# EasyEDA Pro project pmod_adapter.eprj

# Schematic Schematic1
Board Name: Board1; Create Date: 2026-10-15; Page Name: P1; Project Name: PMOD_Adapter board; Schematic Name: Schematic1; Update Date: 2026-10-17; Company: 嘉立创EDA; Page Size: A4; Version: V1.0
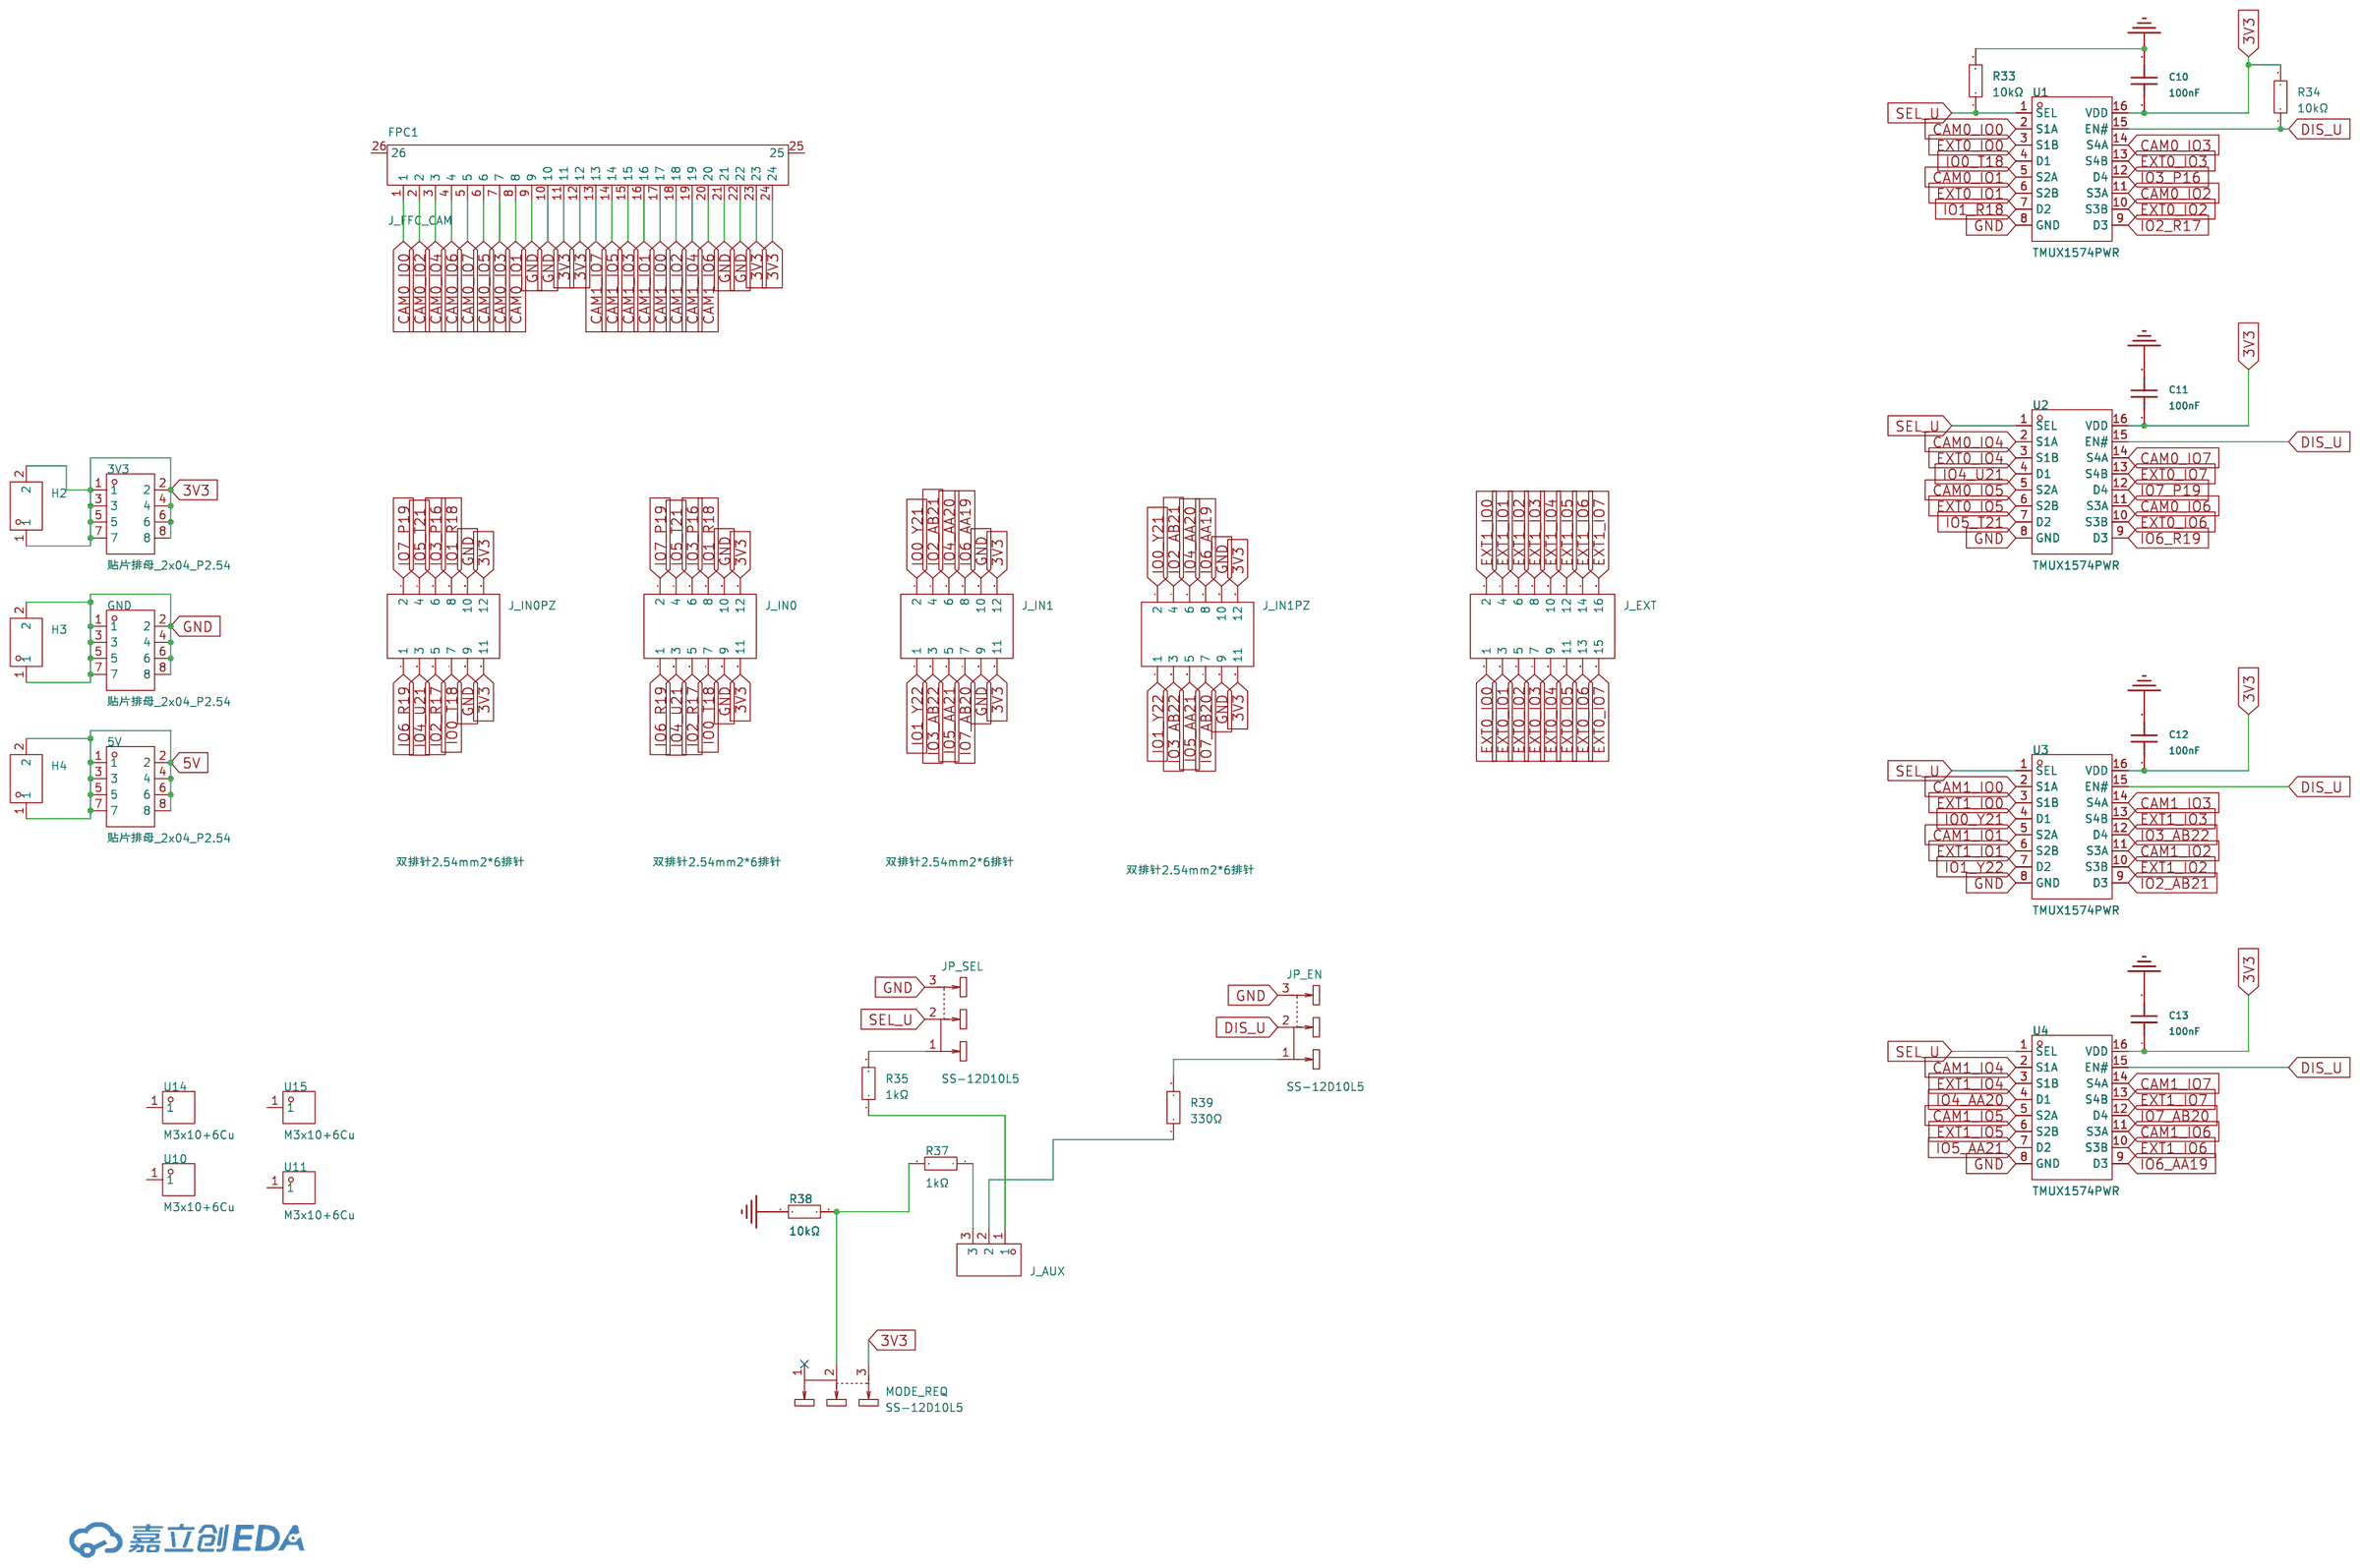
[diagram p0: schematic sheet]

## Parts
3V3  贴片排母_2x04_P2.54  [HDR-SMD_8P-P2.54-V-F-R2-C4-S7.1]
5V  贴片排母_2x04_P2.54  [HDR-SMD_8P-P2.54-V-F-R2-C4-S7.1]
C10  100nF  [C0603]
C11  100nF  [C0603]
C12  100nF  [C0603]
C13  100nF  [C0603]
FPC1  J_FFC_CAM  [FPC-SMD_24P-P0.50_MLD-FPC-05F-24P-H15]
GND  贴片排母_2x04_P2.54  [HDR-SMD_8P-P2.54-V-F-R2-C4-S7.1]
H2  -  [HDR-TH_2P-P2.54-V-M-2]
H3  -  [HDR-TH_2P-P2.54-V-M-2]
H4  -  [HDR-TH_2P-P2.54-V-M-2]
J_AUX  -  [HDR-TH_3P-P2.54-V-M]
J_EXT  -  [HDR-TH_16P-P2.54-V-M-R2-C8-S2.54]
J_IN0  双排针2.54mm2*6排针  [HDR-TH_12P-P2.54-V-M-R2-C6-S2.54]
J_IN0PZ  双排针2.54mm2*6排针  [HDR-TH_12P-P2.54-V-M-R2-C6-S2.54]
J_IN1  双排针2.54mm2*6排针  [HDR-TH_12P-P2.54-V-M-R2-C6-S2.54]
J_IN1PZ  双排针2.54mm2*6排针  [HDR-TH_12P-P2.54-V-M-R2-C6-S2.54]
JP_EN  SS-12D10L5  [SW-TH_SS-12D10L5]
JP_SEL  SS-12D10L5  [SW-TH_SS-12D10L5]
MODE_REQ  SS-12D10L5  [SW-TH_SS-12D10L5]
R33  10kΩ  [R0805]
R34  10kΩ  [R0805]
R35  1kΩ  [R0805]
R37  1kΩ  [R0805]
R38  10kΩ  [R0805]
R39  330Ω  [R0805]
U1  TMUX1574PWR  [TSSOP-16_L5.0-W4.4-P0.65-LS6.4-BL]
U2  TMUX1574PWR  [TSSOP-16_L5.0-W4.4-P0.65-LS6.4-BL]
U3  TMUX1574PWR  [TSSOP-16_L5.0-W4.4-P0.65-LS6.4-BL]
U4  TMUX1574PWR  [TSSOP-16_L5.0-W4.4-P0.65-LS6.4-BL]
U10  M3x10+6Cu  [SMD_L4.7-W4.7-D3.0]
U11  M3x10+6Cu  [SMD_L4.7-W4.7-D3.0]
U14  M3x10+6Cu  [SMD_L4.7-W4.7-D3.0]
U15  M3x10+6Cu  [SMD_L4.7-W4.7-D3.0]

## Library data of the parts
3V3 5V GND = 贴片排母_2x04_P2.54: Supplier Part: C9900001627; Supplier Footprint: SMD-8_L10.16-W5.0-P2.54-LS7.14; JLCPCB Part Class: 扩展库; Supplier: LCSC
C10-C13 = CC0603KRX7R9BB104: 容值:100nF;精度:±10%;额定电压:50V;温度系数:X7R;; LCSC Part Name: 100nF ±10% 50V; Supplier Part: C14663; Manufacturer: YAGEO(国巨); Supplier Footprint: 0603; JLCPCB Part Class: 基础库; Datasheet: https://item.szlcsc.com/datasheet/CC0603KRX7R9BB104/15331.html; Supplier: LCSC; Tolerance: ±10%; Voltage Rating: 50V; Temperature Coefficient: X7R
FPC1 = MLD-FPC-05F-24P-H15: LCSC Part Name: 0.5PH 1.5H 掀盖FPC 24P; Supplier Part: C54333838; Manufacturer: Minlenda(敏连达); Supplier Footprint: SMD,P=0.5mm,卧贴; JLCPCB Part Class: 扩展库; Datasheet: https://item.szlcsc.com/datasheet/MLD-FPC-05F-24P-H15/57627873.html; Supplier: LCSC
H2-H4 = HDR-M_2.54_2x1: Supplier Part: C2883961; Supplier Footprint: 插件,P=2.54mm; JLCPCB Part Class: 扩展库
J_AUX = HDR-M_2.54_1x3P: Supplier Part: C2937625; Supplier Footprint: 插件; JLCPCB Part Class: 扩展库
J_EXT = HDR-M_2.54_2x8: Supplier Part: C68234; Supplier Footprint: 插件,P=2.54mm; JLCPCB Part Class: 扩展库
J_IN0 J_IN0PZ J_IN1 J_IN1PZ = 双排针2.54mm2*6排针: LCSC Part Name: 双排针2*6  间距2.54mm; Supplier Part: C66689; Supplier Footprint: 插件; JLCPCB Part Class: 扩展库; Supplier: LCSC
JP_EN JP_SEL MODE_REQ = SS-12D10L5: LCSC Part Name: 柄长5mm 直插双档 滑动开关; Supplier Part: C319012; Manufacturer: XKB Connection(中国星坤); Supplier Footprint: 插件,13x6.8mm; JLCPCB Part Class: 扩展库; Datasheet: https://item.szlcsc.com/datasheet/SS-12D10L5/300104.html; Supplier: LCSC; Circuit: 单刀双掷; Actuator Style: 矩形柱状; Termination Style: PC引脚; Length: 13mm; Width: 6.8mm; Switch Height: 6.4mm; Mounting Type: 直插; Actuator Color: 黑色; Current Rating: 3A; Voltage Rating: 125V; Life: 1万次; Operating Temperature: -40℃~+85℃
R33 R34 R38 = 0805W8F1002T5E_C17414: 电阻类型:厚膜电阻;阻值:10kΩ;精度:±1%;功率:125mW;工作电压:150V;温度系数:±100ppm/℃;; LCSC Part Name: 厚膜电阻 10kΩ ±1%; Supplier Part: C17414; Manufacturer: UNI-ROYAL(厚声); Manufacturer Part: 0805W8F1002T5E; Supplier Footprint: 0805; JLCPCB Part Class: 基础库; Datasheet: https://item.szlcsc.com/datasheet/0805W8F1002T5E/18102.html; Supplier: LCSC; Type: 厚膜电阻; Tolerance: ±1%; Power(Watts): 125mW; Voltage-Supply(Max): 150V; Temperature Coefficient: ±100ppm/℃; Operating Temperature: -55℃~+155℃
R35 R37 = 0805W8F1001T5E: LCSC Part Name: 1kΩ ±1% 125mW 厚膜电阻; Supplier Part: C17513; Manufacturer: UNI-ROYAL(厚声); Supplier Footprint: 0805; JLCPCB Part Class: 基础库; Datasheet: https://atta.szlcsc.com/upload/public/pdf/source/20200306/C422600_1E6D84923E4A46A82E41ADD87F860B5C.pdf; Supplier: LCSC; Type: 厚膜电阻; Tolerance: ±1%; Power(Watts): 125mW; Overload Voltage (Max): 150V; Temperature Coefficient: ±100ppm/℃; Operating Temperature Range: -55℃~+155℃
R39 = 0805W8F3300T5E: LCSC Part Name: 厚膜电阻 330Ω ±1%; Supplier Part: C17630; Manufacturer: UNI-ROYAL(厚声); Supplier Footprint: 0805; JLCPCB Part Class: 基础库; Datasheet: https://item.szlcsc.com/datasheet/0805W8F3300T5E/18318.html; Supplier: LCSC; Type: 厚膜电阻; Tolerance: ±1%; Power(Watts): 125mW; Voltage-Supply(Max): 150V; Temperature Coefficient: ±100ppm/℃; Operating Temperature: -55℃~+155℃
U1-U4 = TMUX1574PWR: LCSC Part Name: TMUX1574低电容、2:1(SPDT)4通道断电保护开关; Supplier Part: C2673443; Manufacturer: TI(德州仪器); Supplier Footprint: TSSOP-16; JLCPCB Part Class: 扩展库; Datasheet: https://www.ti.com/cn/lit/ds/symlink/tmux1574.pdf; Supplier: LCSC; Switch Circuit: 2:1; Number of Channels: 4; Ron: 2Ω; Voltage - Supply: 1.5V~5.5V; Con: 7.5pF; Turn-on time: 35ns; Bandwidth: 2GHz; Operating Temperature: -40℃~+125℃; Propagation Delay (tpd): 95ps; Features: 双向模拟通道；断电隔离；故障保护；失效安全断开
U10 U11 U14 U15 = M3x10+6Cu: M3x10+6; LCSC Part Name: Shuntian(顺天五金) 单头六角隔离铜柱螺柱 M3X10+6 国标 黄铜 袋装; Supplier Part: C551322; Manufacturer: Shuntian(顺天五金); JLCPCB Part Class: 扩展库; Datasheet: https://item.szlcsc.com/datasheet/M3x10%252B6Cu/575012.html; Supplier: LCSC

## Nets
3V3: 3V3.1 3V3.2 3V3.3 3V3.4 3V3.5 3V3.6 3V3.7 3V3.8 C10.1 C11.1 C12.1 C13.1 FPC1.11 FPC1.12 FPC1.23 FPC1.24 H2.1 H2.2 J_IN0.11 J_IN0.12 J_IN0PZ.11 J_IN0PZ.12 J_IN1.11 J_IN1.12 J_IN1PZ.11 J_IN1PZ.12 MODE_REQ.3 R34.2 U1.16(VDD) U2.16(VDD) U3.16(VDD) U4.16(VDD)
5V: 5V.1 5V.2 5V.3 5V.4 5V.5 5V.6 5V.7 5V.8 H4.1 H4.2
GND: C10.2 C11.2 C12.2 C13.2 FPC1.9 FPC1.10 FPC1.21 FPC1.22 GND.1 GND.2 GND.3 GND.4 GND.5 GND.6 GND.7 GND.8 H3.1 H3.2 J_IN0.9 J_IN0.10 J_IN0PZ.9 J_IN0PZ.10 J_IN1.9 J_IN1.10 J_IN1PZ.9 J_IN1PZ.10 JP_EN.3 JP_SEL.3 R33.2 R38.1 U1.8(GND) U2.8(GND) U3.8(GND) U4.8(GND)
CAM0_IO0: FPC1.1 U1.2(S1A)
CAM0_IO1: FPC1.8 U1.5(S2A)
CAM0_IO2: FPC1.2 U1.11(S3A)
CAM0_IO3: FPC1.7 U1.14(S4A)
CAM0_IO4: FPC1.3 U2.2(S1A)
CAM0_IO5: FPC1.6 U2.5(S2A)
CAM0_IO6: FPC1.4 U2.11(S3A)
CAM0_IO7: FPC1.5 U2.14(S4A)
CAM1_IO0: FPC1.17 U3.2(S1A)
CAM1_IO1: FPC1.16 U3.5(S2A)
CAM1_IO2: FPC1.18 U3.11(S3A)
CAM1_IO3: FPC1.15 U3.14(S4A)
CAM1_IO4: FPC1.19 U4.2(S1A)
CAM1_IO5: FPC1.14 U4.5(S2A)
CAM1_IO6: FPC1.20 U4.11(S3A)
CAM1_IO7: FPC1.13 U4.14(S4A)
DIS_U: JP_EN.2 R34.1 U1.15(EN#) U2.15(EN#) U3.15(EN#) U4.15(EN#)
EXT0_IO0: J_EXT.1 U1.3(S1B)
EXT0_IO1: J_EXT.3 U1.6(S2B)
EXT0_IO2: J_EXT.5 U1.10(S3B)
EXT0_IO3: J_EXT.7 U1.13(S4B)
EXT0_IO4: J_EXT.9 U2.3(S1B)
EXT0_IO5: J_EXT.11 U2.6(S2B)
EXT0_IO6: J_EXT.13 U2.10(S3B)
EXT0_IO7: J_EXT.15 U2.13(S4B)
EXT1_IO0: J_EXT.2 U3.3(S1B)
EXT1_IO1: J_EXT.4 U3.6(S2B)
EXT1_IO2: J_EXT.6 U3.10(S3B)
EXT1_IO3: J_EXT.8 U3.13(S4B)
EXT1_IO4: J_EXT.10 U4.3(S1B)
EXT1_IO5: J_EXT.12 U4.6(S2B)
EXT1_IO6: J_EXT.14 U4.10(S3B)
EXT1_IO7: J_EXT.16 U4.13(S4B)
IO0_T18: J_IN0.7 J_IN0PZ.7 U1.4(D1)
IO0_Y21: J_IN1.2 J_IN1PZ.2 U3.4(D1)
IO1_R18: J_IN0.8 J_IN0PZ.8 U1.7(D2)
IO1_Y22: J_IN1.1 J_IN1PZ.1 U3.7(D2)
IO2_AB21: J_IN1.4 J_IN1PZ.4 U3.9(D3)
IO2_R17: J_IN0.5 J_IN0PZ.5 U1.9(D3)
IO3_AB22: J_IN1.3 J_IN1PZ.3 U3.12(D4)
IO3_P16: J_IN0.6 J_IN0PZ.6 U1.12(D4)
IO4_AA20: J_IN1.6 J_IN1PZ.6 U4.4(D1)
IO4_U21: J_IN0.3 J_IN0PZ.3 U2.4(D1)
IO5_AA21: J_IN1.5 J_IN1PZ.5 U4.7(D2)
IO5_T21: J_IN0.4 J_IN0PZ.4 U2.7(D2)
IO6_AA19: J_IN1.8 J_IN1PZ.8 U4.9(D3)
IO6_R19: J_IN0.1 J_IN0PZ.1 U2.9(D3)
IO7_AB20: J_IN1.7 J_IN1PZ.7 U4.12(D4)
IO7_P19: J_IN0.2 J_IN0PZ.2 U2.12(D4)
SEL_U: JP_SEL.2 R33.1 U1.1(SEL) U2.1(SEL) U3.1(SEL) U4.1(SEL)
$1N8696: J_AUX.1 R35.1
$1N8701: J_AUX.2 R39.1
$1N8888: JP_SEL.1 R35.2
$1N8898: JP_EN.1 R39.2
$1N9028: J_AUX.3 R37.1
$1N9037: MODE_REQ.2 R37.2 R38.2

Not connected (* = marked no-connect by the designer): FPC1 25 26; MODE_REQ 1*; U10 1; U11 1; U14 1; U15 1

# Schematic Schematic2
Board Name: Board2; Create Date: 2026-10-18; Page Name: P1; Project Name: PMOD_Adapter board; Schematic Name: Schematic2; Update Date: 2026-10-18; Company: 嘉立创EDA; Page Size: A4; Version: V1.0
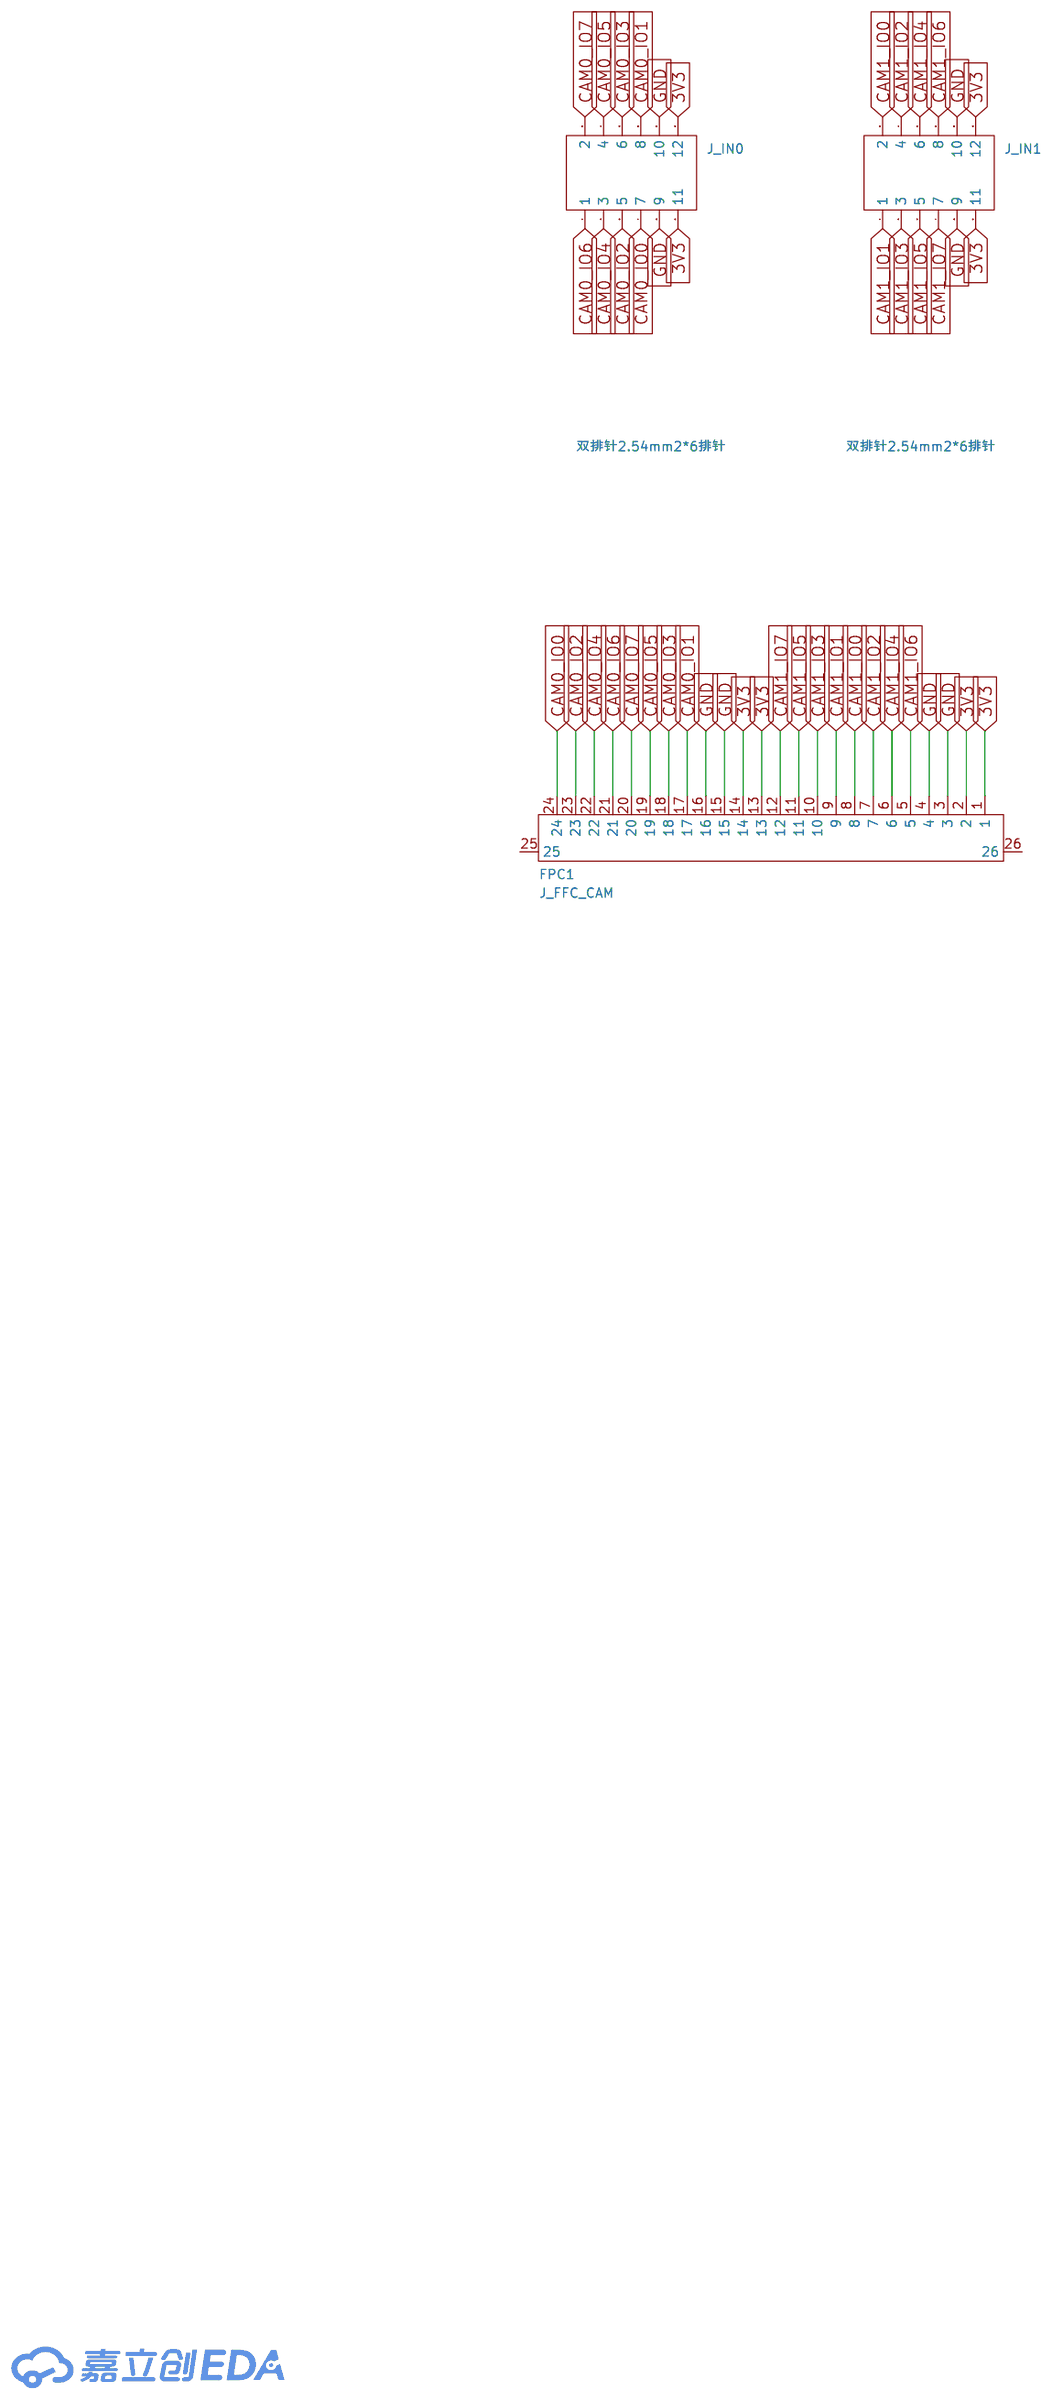
[diagram p1: schematic sheet]

## Parts
FPC1  J_FFC_CAM  [FPC-SMD_24P-P0.50_MLD-FPC-05F-24P-H15]
J_IN0  双排针2.54mm2*6排针  [HDR-TH_12P-P2.54-V-M-R2-C6-S2.54]
J_IN1  双排针2.54mm2*6排针  [HDR-TH_12P-P2.54-V-M-R2-C6-S2.54]

## Library data of the parts
FPC1 = MLD-FPC-05F-24P-H15: LCSC Part Name: 0.5PH 1.5H 掀盖FPC 24P; Supplier Part: C54333838; Manufacturer: Minlenda(敏连达); Supplier Footprint: SMD,P=0.5mm,卧贴; JLCPCB Part Class: 扩展库; Datasheet: https://item.szlcsc.com/datasheet/MLD-FPC-05F-24P-H15/57627873.html; Supplier: LCSC
J_IN0 J_IN1 = 双排针2.54mm2*6排针: LCSC Part Name: 双排针2*6  间距2.54mm; Supplier Part: C66689; Supplier Footprint: 插件; JLCPCB Part Class: 扩展库; Supplier: LCSC

## Nets
3V3: FPC1.1 FPC1.2 FPC1.13 FPC1.14 J_IN0.11 J_IN0.12 J_IN1.11 J_IN1.12
GND: FPC1.3 FPC1.4 FPC1.15 FPC1.16 J_IN0.9 J_IN0.10 J_IN1.9 J_IN1.10
CAM0_IO0: FPC1.24 J_IN0.7
CAM0_IO1: FPC1.17 J_IN0.8
CAM0_IO2: FPC1.23 J_IN0.5
CAM0_IO3: FPC1.18 J_IN0.6
CAM0_IO4: FPC1.22 J_IN0.3
CAM0_IO5: FPC1.19 J_IN0.4
CAM0_IO6: FPC1.21 J_IN0.1
CAM0_IO7: FPC1.20 J_IN0.2
CAM1_IO0: FPC1.8 J_IN1.2
CAM1_IO1: FPC1.9 J_IN1.1
CAM1_IO2: FPC1.7 J_IN1.4
CAM1_IO3: FPC1.10 J_IN1.3
CAM1_IO4: FPC1.6 J_IN1.6
CAM1_IO5: FPC1.11 J_IN1.5
CAM1_IO6: FPC1.5 J_IN1.8
CAM1_IO7: FPC1.12 J_IN1.7

Not connected (* = marked no-connect by the designer): FPC1 25 26

# Board PCB1
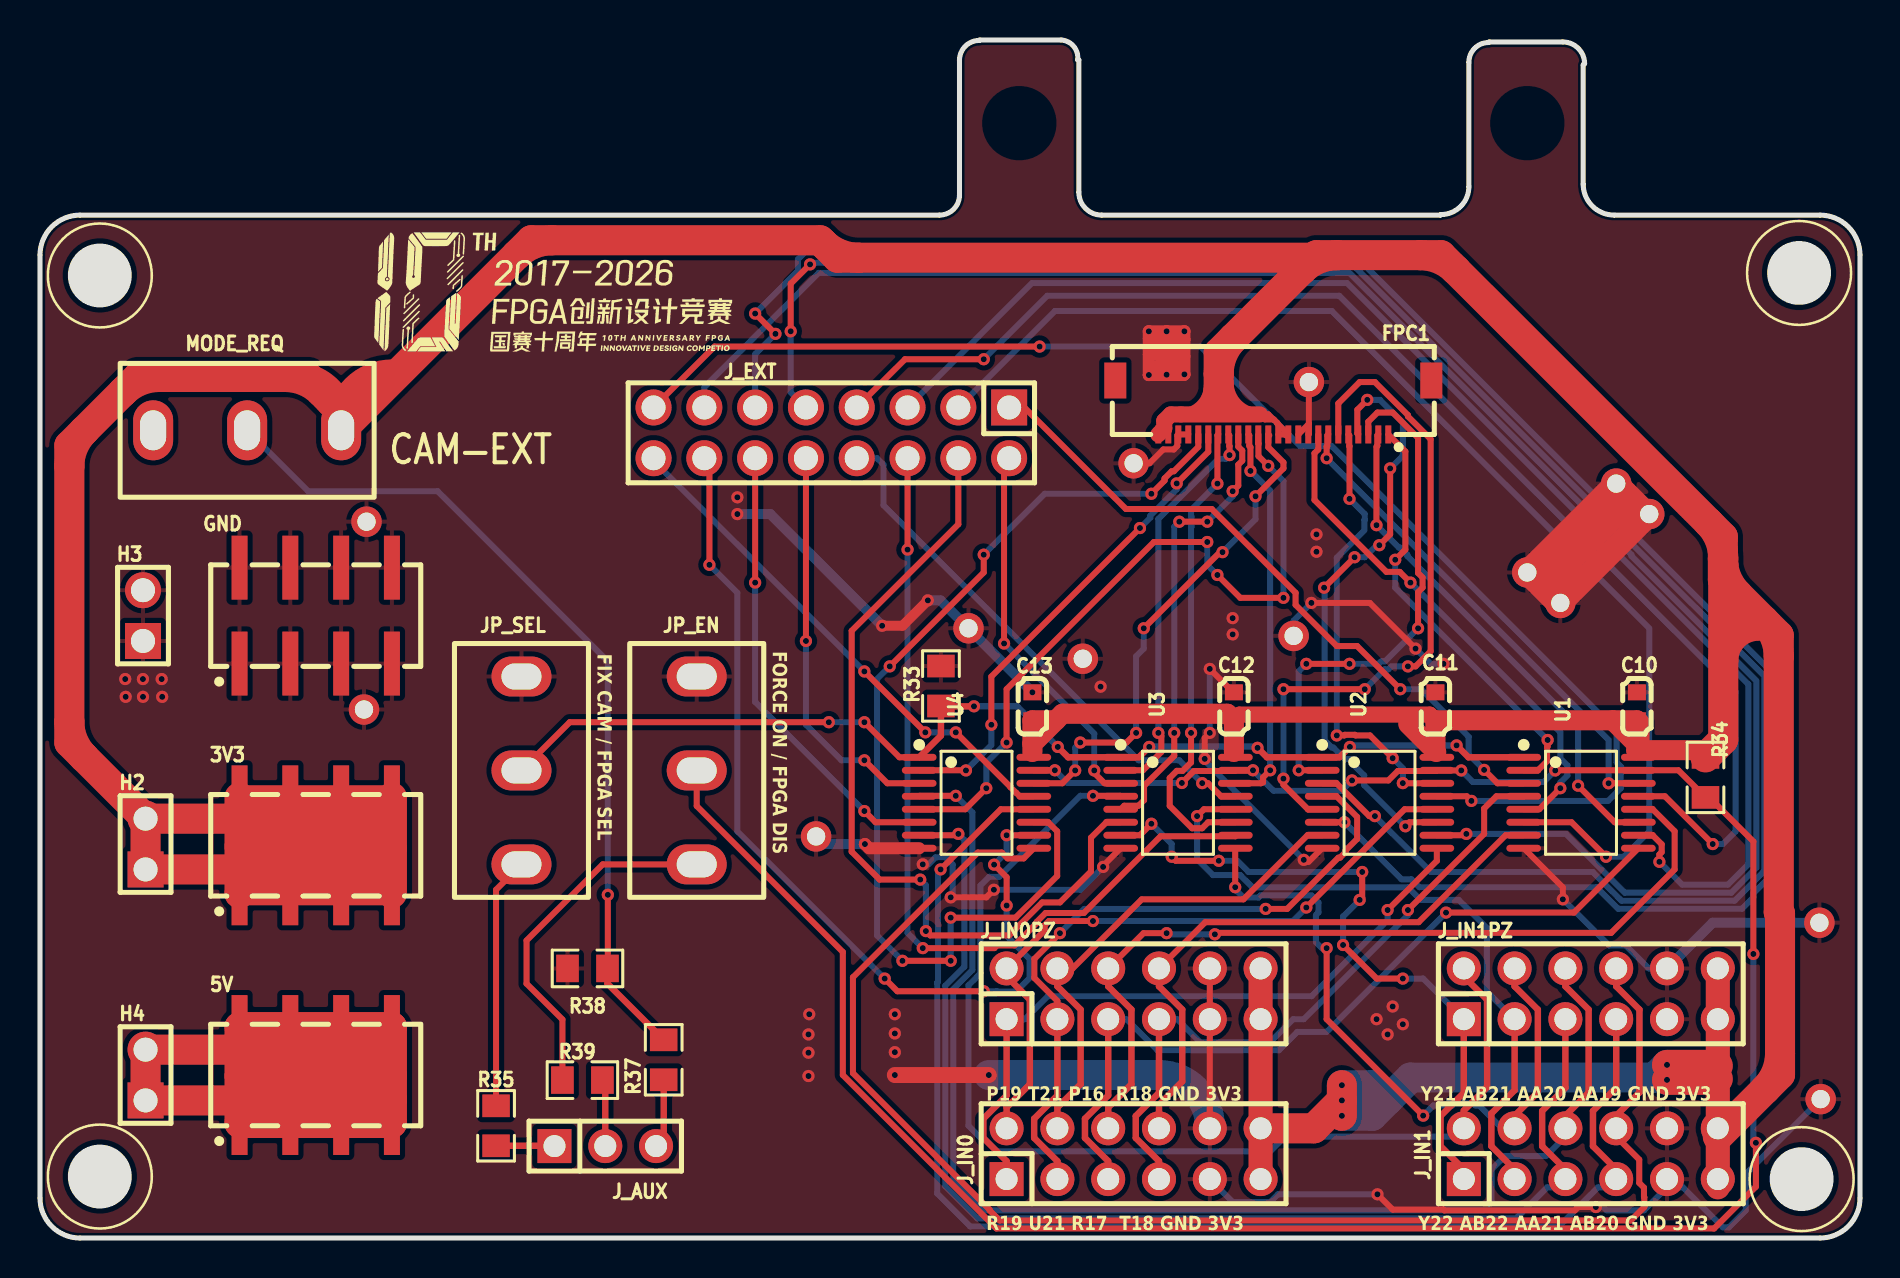
[diagram p2: board, top side]
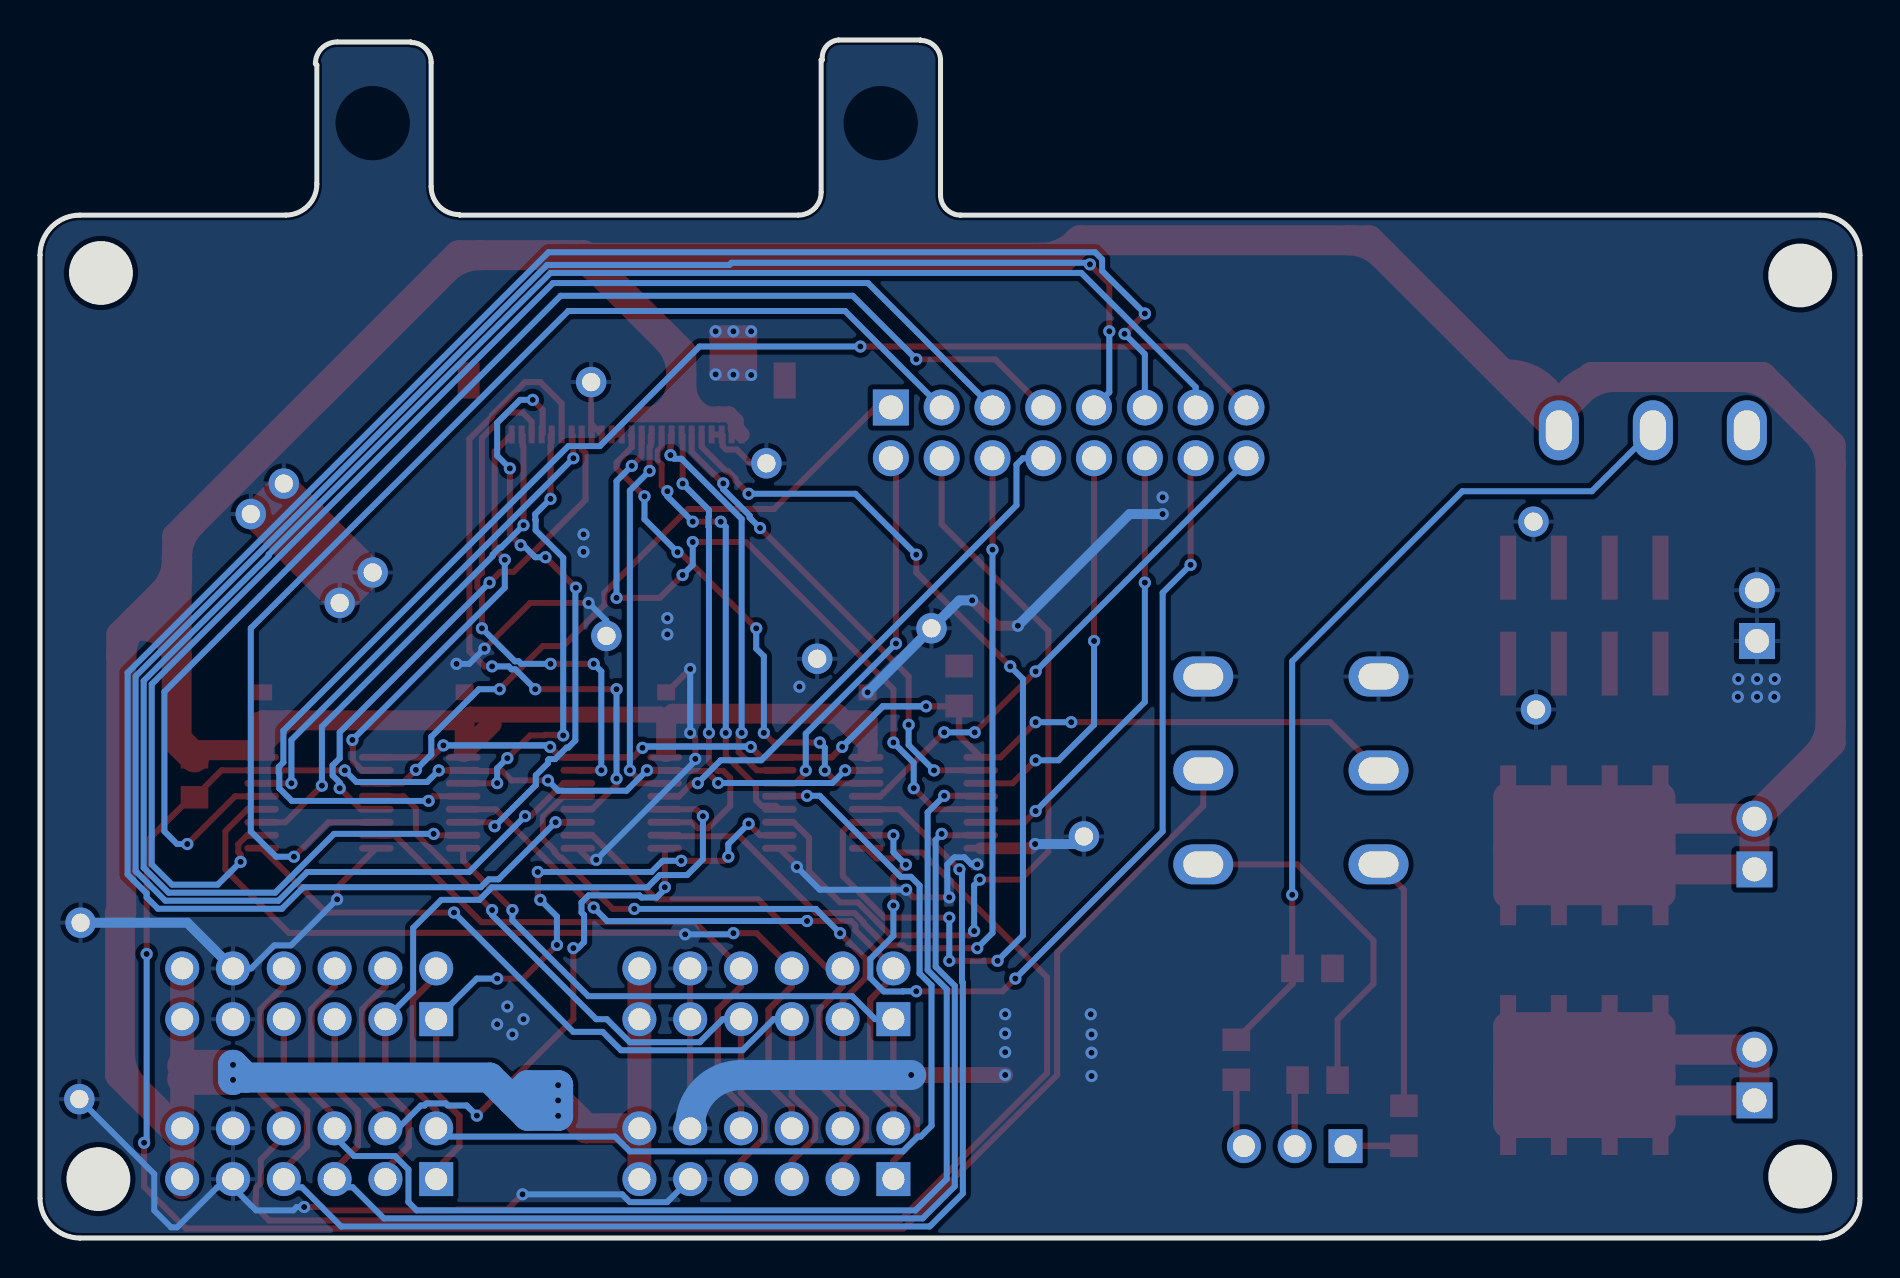
[diagram p3: board, bottom side, seen from below]

Outline 91 x 59.94 mm; copper layers: Top Layer, Bottom Layer. Coordinates in mm from the lower left corner of the outline.
Outline path: 0,49.18 0,2 arc(0.59,0.59) 2,0 89,0 arc(90.41,0.59) 91,2 91,49.18 arc(90.41,50.6) 89,51.18 78.71,51.18 arc(77.61,51.64) 77.16,52.73 77.16,58.69 arc(77.18,58.74) 77.23,58.76 arc(76.91,59.53) 76.14,59.84 72.46,59.84 arc(72.44,59.84) 72.43,59.82 arc(71.73,59.53) 71.44,58.83 71.44,52.61 arc(71.03,51.62) 70.05,51.21 arc(70.04,51.19) 70.02,51.18 53.09,51.18 arc(52.28,51.52) 51.94,52.32 51.94,58.94 arc(51.91,58.92) 51.89,58.96 arc(51.68,59.63) 51.05,59.94 46.99,59.94 arc(46.97,59.94) 46.97,59.92 arc(46.26,59.63) 45.97,58.93 45.97,52.18 arc(45.68,51.47) 44.97,51.18 2,51.18 arc(0.59,50.6) 0,49.18
Stack: Top Layer 0.035mm / Dielectric1 1.51mm FR4 er 4.5 / Bottom Layer 0.035mm

## Design rules (mm)
template: JLCPCB Capability(Two Layers Board)
spacing copperThickness1oz (default): track to track 0.102, other pairs 0.152 to 0.3
spacing copperThickness2oz: track to track 0.203, other pairs 0.152 to 0.3
track width copperThickness1oz (default): min 0.127, default 0.254, max 2.54
track width copperThickness2oz: min 0.203, default 0.254, max 2.54
differential pair differentialPair (default): width min 0.127, default 0.254, max 2.54; gap min 0.152, default 0.152
via viaSize (default): diameter min 0.5, default 0.61, max 10; hole min 0.3, default 0.305, max 6.3

## Placement (name value [footprint] x y rotation side)
3V3  贴片排母_2x04_P2.54  [HDR-SMD_8P-P2.54-V-F-R2-C4-S7.1]  13.79 19.65 0 top
5V  贴片排母_2x04_P2.54  [HDR-SMD_8P-P2.54-V-F-R2-C4-S7.1]  13.79 8.16 0 top
C10  100nF  [C0603]  79.85 26.6 90 top
C11  100nF  [C0603]  69.77 26.6 90 top
C12  100nF  [C0603]  59.69 26.6 90 top
C13  100nF  [C0603]  49.62 26.6 90 top
FPC1  J_FFC_CAM  [FPC-SMD_24P-P0.50_MLD-FPC-05F-24P-H15]  61.67 41.56 180 top
GND  贴片排母_2x04_P2.54  [HDR-SMD_8P-P2.54-V-F-R2-C4-S7.1]  13.79 31.14 0 top
H2  -  [HDR-TH_2P-P2.54-V-M-2]  5.28 19.71 0 top
H3  -  [HDR-TH_2P-P2.54-V-M-2]  5.15 31.14 0 top
H4  -  [HDR-TH_2P-P2.54-V-M-2]  5.28 8.16 0 top
J_AUX  -  [HDR-TH_3P-P2.54-V-M]  28.26 4.6 0 top
J_EXT  -  [HDR-TH_16P-P2.54-V-M-R2-C8-S2.54]  39.57 40.29 180 top
J_IN0  双排针2.54mm2*6排针  [HDR-TH_12P-P2.54-V-M-R2-C6-S2.54]  54.68 4.22 0 top
J_IN0PZ  双排针2.54mm2*6排针  [HDR-TH_12P-P2.54-V-M-R2-C6-S2.54]  54.68 12.22 0 top
J_IN1  双排针2.54mm2*6排针  [HDR-TH_12P-P2.54-V-M-R2-C6-S2.54]  77.54 4.22 0 top
J_IN1PZ  双排针2.54mm2*6排针  [HDR-TH_12P-P2.54-V-M-R2-C6-S2.54]  77.54 12.22 0 top
JP_EN  SS-12D10L5  [SW-TH_SS-12D10L5]  32.84 23.4 90 top
JP_SEL  SS-12D10L5  [SW-TH_SS-12D10L5]  24.07 23.4 90 top
MODE_REQ  SS-12D10L5  [SW-TH_SS-12D10L5]  10.36 40.41 0 top
NOREF  -  [Pad_e2267]  76.02 31.78 0 top
NOREF#2  -  [Pad_e2262]  16.2 26.44 0 top
NOREF#3  -  [Pad_e2261]  16.33 35.84 0 top
NOREF#4  -  [Pad_e4352]  89.03 6.95 0 top
NOREF#5  -  [Pad_e2724]  74.36 33.3 0 top
NOREF#6  -  [Pad_e3508]  46.42 30.51 0 top
NOREF#7  -  [Pad_e3770]  38.8 20.09 0 top
NOREF#8  -  [Pad_e2264]  54.68 38.76 0 top
NOREF#9  -  [Pad_e2266]  62.68 30.13 0 top
NOREF#10  -  [Pad_e2275]  63.44 42.83 0 top
NOREF#11  -  [Pad_e2265]  52.14 28.98 0 top
NOREF#12  -  [Pad_e4041]  88.97 15.78 0 top
NOREF#13  -  [Pad_e2723]  78.81 37.75 0 top
NOREF#14  -  [Pad_e2722]  80.46 36.22 0 top
R33  10kΩ  [R0805]  45.05 27.62 90 top
R34  10kΩ  [R0805]  83.27 23.05 90 top
R35  1kΩ  [R0805]  22.8 5.62 90 top
R37  1kΩ  [R0805]  31.19 8.92 90 top
R38  10kΩ  [R0805]  27.38 13.49 0 top
R39  330Ω  [R0805]  27.12 7.9 180 top
U1  TMUX1574PWR  [TSSOP-16_L5.0-W4.4-P0.65-LS6.4-BL]  77.05 21.78 270 top
U2  TMUX1574PWR  [TSSOP-16_L5.0-W4.4-P0.65-LS6.4-BL]  66.98 21.78 270 top
U3  TMUX1574PWR  [TSSOP-16_L5.0-W4.4-P0.65-LS6.4-BL]  56.9 21.78 270 top
U4  TMUX1574PWR  [TSSOP-16_L5.0-W4.4-P0.65-LS6.4-BL]  46.83 21.78 270 top
U10  M3x10+6Cu  [SMD_L4.7-W4.7-D3.0]  2.99 48.16 0 top
U11  M3x10+6Cu  [SMD_L4.7-W4.7-D3.0]  87.95 48.29 0 top
U14  M3x10+6Cu  [SMD_L4.7-W4.7-D3.0]  2.99 3.08 0 top
U15  M3x10+6Cu  [SMD_L4.7-W4.7-D3.0]  88.08 2.95 0 top

## Footprints (pads in the part's own frame, mm; a bottom-side part is the same pattern mirrored in y, then rotated)
C0603
  rect 0.8x0.9 smd: 1(-0.7,0) 2(0.7,0)
FPC-SMD_24P-P0.50_MLD-FPC-05F-24P-H15
  rect 0.3x0.9 smd: 1(-5.75,1.35) 2(-5.25,1.35) 3(-4.75,1.35) 4(-4.25,1.35) 5(-3.75,1.35) 6(-3.25,1.35) 7(-2.75,1.35) 8(-2.25,1.35) 9(-1.75,1.35) 10(-1.25,1.35) 11(-0.75,1.35) 12(-0.25,1.35) 13(0.25,1.35) 14(0.75,1.35) 15(1.25,1.35) 16(1.75,1.35) 17(2.25,1.35) 18(2.75,1.35) 19(3.25,1.35) 20(3.75,1.35) 21(4.25,1.35) 22(4.75,1.35) 23(5.25,1.35) 24(5.75,1.35)
  rect 1.1x1.8 smd: 25(7.9,-1.35) 26(-7.9,-1.35)
HDR-SMD_8P-P2.54-V-F-R2-C4-S7.1
  rect 0.8x3.2 smd: 1(-3.81,-2.4) 2(-3.81,2.4) 3(-1.27,-2.4) 4(-1.27,2.4) 5(1.27,-2.4) 6(1.27,2.4) 7(3.81,-2.4) 8(3.81,2.4)
HDR-TH_2P-P2.54-V-M-2
  rect 1.8x1.8 hole 1.2: 1(0,-1.27)
  round 1.8 hole 1.2: 2(0,1.27)
HDR-TH_3P-P2.54-V-M
  rect 1.7x1.7 hole 1.1: 1(-2.54,0)
  round 1.7 hole 1.1: 2(0,0) 3(2.54,0)
HDR-TH_12P-P2.54-V-M-R2-C6-S2.54
  rect 1.7x1.7 hole 1.1: 1(-6.35,-1.27)
  round 1.7 hole 1.1: 2(-6.35,1.27) 3(-3.81,-1.27) 4(-3.81,1.27) 5(-1.27,-1.27) 6(-1.27,1.27) 7(1.27,-1.27) 8(1.27,1.27) 9(3.81,-1.27) 10(3.81,1.27) 11(6.35,-1.27) 12(6.35,1.27)
HDR-TH_16P-P2.54-V-M-R2-C8-S2.54
  rect 1.8x1.8 hole 1.2: 1(-8.89,-1.27)
  round 1.8 hole 1.2: 2(-8.89,1.27) 3(-6.35,-1.27) 4(-6.35,1.27) 5(-3.81,-1.27) 6(-3.81,1.27) 7(-1.27,-1.27) 8(-1.27,1.27) 9(1.27,-1.27) 10(1.27,1.27) 11(3.81,-1.27) 12(3.81,1.27) 13(6.35,-1.27) 14(6.35,1.27) 15(8.89,-1.27) 16(8.89,1.27)
Pad_e2261
  round 1.524 hole 0.914: 1(0,0)
Pad_e2262
  round 1.524 hole 0.914: 2(0,0)
Pad_e2264
  round 1.524 hole 0.914: 1(0,0)
Pad_e2265
  round 1.524 hole 0.914: 1(0,0)
Pad_e2266
  round 1.524 hole 0.914: 1(0,0)
Pad_e2267
  round 1.524 hole 0.914: 1(0,0)
Pad_e2275
  round 1.524 hole 0.914: 1(0,0)
Pad_e2722
  round 1.524 hole 0.914: 1(0,0)
Pad_e2723
  round 1.524 hole 0.914: 2(0,0)
Pad_e2724
  round 1.524 hole 0.914: 3(0,0)
Pad_e3508
  round 1.524 hole 0.914: 1(0,0)
Pad_e3770
  round 1.524 hole 0.914: 1(0,0)
Pad_e4041
  round 1.524 hole 0.914: 1(0,0)
Pad_e4352
  round 1.524 hole 0.914: 1(0,0)
R0805
  rect 1.133x1.377 smd: 1(-1,0) 2(1,0)
SW-TH_SS-12D10L5
  oval 2x3 hole 1.3x2: 1(-4.7,0) 2(0,0) 3(4.7,0)
TSSOP-16_L5.0-W4.4-P0.65-LS6.4-BL
  oval 0.343x1.732 smd: 1(-2.275,-2.866) 2(-1.625,-2.866) 3(-0.975,-2.866) 4(-0.325,-2.866) 5(0.325,-2.866) 6(0.975,-2.866) 7(1.625,-2.866) 8(2.275,-2.866) 9(2.275,2.866) 10(1.625,2.866) 11(0.975,2.866) 12(0.325,2.866) 13(-0.325,2.866) 14(-0.975,2.866) 15(-1.625,2.866) 16(-2.275,2.866)

## Nets
As in the schematic, except:
GND: C10.2 C11.2 C12.2 C13.2 FPC1.9 FPC1.10 FPC1.21 FPC1.22 GND.1 GND.2 GND.3 GND.4 GND.5 GND.6 GND.7 GND.8 H3.1 H3.2 J_IN0.9 J_IN0.10 J_IN0PZ.9 J_IN0PZ.10 J_IN1.9 J_IN1.10 J_IN1PZ.9 J_IN1PZ.10 JP_EN.3 JP_SEL.3 NOREF.1 NOREF#2.2 NOREF#3.1 NOREF#4.1 NOREF#5.3 NOREF#6.1 NOREF#7.1 NOREF#8.1 NOREF#9.1 NOREF#10.1 NOREF#11.1 NOREF#12.1 NOREF#13.2 NOREF#14.1 R33.2 R38.1 U1.8 U2.8 U3.8 U4.8

Pads without a net: FPC1 25 26; MODE_REQ 1

## Via types
v1: diameter 0.61, hole 0.305, Top Layer to Bottom Layer, 189 vias

## Routing (per net, layer and track width the routed paths; a pad name or vN(x,y) marks a point on that pad's centre or on a via; arc(x,y) is an arc through that point)
3V3: length 394.2
  Top Layer w0.3: FPC1.12 62.25,40.21 62.3,40.16 ; FPC1.11 61.87,40.75 61.87,40.78 61.69,40.96 61.66,40.96 ; 61.66,40.96 61.25,40.96 61,41.21 61.41,41.21 61.66,40.96
  Top Layer w0.6: 61,41.21 arc(59.85,41.68) 59.38,42.83 ; 57.05,41.21 arc(58.07,41.63) 58.49,42.65
  Top Layer w0.8: FPC1.24 56.21,40.5 56.21,40.89 56.54,41.21 61,41.21 ; C12.1 59.98,26.19 69.48,26.19 C11.1
  Top Layer w1: 79.97,24.57 78.64,25.9 ; 79.97,24.57 79.97,25.78 C10.1 78.64,25.9 ; 79.97,24.57 79.81,24.41 82.91,24.41 R34.2 ; 78.64,25.9 C11.1 69.77,24.36 ; 50.8,25.9 51.13,26.23 59.37,26.23 C12.1 59.69,24.32 ; 50.8,25.9 49.62,24.73 ; 50.8,25.9 C13.1 49.62,24.73 ; 49.62,24.73 49.62,24.32 ; 69.77,24.36 68.42,25.72 ; 69.77,24.36 69.81,24.32
  Top Layer w1.2: J_IN0.11 J_IN0.12 J_IN0PZ.11 J_IN0PZ.12 ; 17.6,19.47 17.48,19.59 15.06,19.59 ; 3V3.6 15.06,19.59 ; 3V3.6 3V3.4 ; 3V3.6 17.22,22.05 ; 12.52,19.59 15.06,19.59 ; 12.52,19.59 9.98,19.59 ; 12.52,19.59 3V3.3 ; 12.52,19.59 3V3.4 ; 15.06,19.59 15.06,17.49 15.29,17.25 ; 15.29,17.25 3V3.5 3V3.3 ; 15.29,17.25 3V3.7 ; 3V3.4 3V3.2 ; 3V3.3 3V3.1 ; 83.89,2.54 J_IN1PZ.11 J_IN1PZ.12
  Top Layer w1.5: R34.2 84.16,24.94 84.16,28.88 ; 14.55,41.85 14.97,41.4 ; 14.55,41.85 14.06,42.34 arc(13.24,42.89) 12.27,43.08 ; 14.55,41.85 13.54,42.94 ; 14.97,41.4 15.06,41.3 15.06,40.8 ; 14.97,41.4 arc(14.44,42.34) 13.54,42.94 ; 14.97,41.4 arc(15.03,41.1) 15.06,40.8 ; 39.13,49.79 39.88,49.05 40.93,49.05 ; 39.13,49.79 39,49.92 25.62,49.92 ; 39.13,49.79 arc(39.96,49.24) 40.93,49.05 ; 2.21,40.4 1.47,39.65 1.47,38.6 ; 2.21,40.4 4.15,42.34 ; 2.21,40.4 arc(1.66,39.57) 1.47,38.6 ; 1.47,25.84 1.47,24.79 2.21,24.05 ; 1.47,25.84 1.47,38.6 ; 1.47,25.84 arc(1.66,24.87) 2.21,24.05 ; 2.21,24.05 H2.2 ; v1(81.35,7.91) 83.84,7.91 83.89,7.96 ; 63.7,49.05 63.08,48.43 ; 63.7,49.05 40.93,49.05 ; 63.7,49.05 63.82,49.18 64.88,49.18 ; 63.08,48.43 59.68,45.03 ; 63.08,48.43 arc(63.9,48.98) 64.88,49.18 ; 84.14,34.32 84.14,33.99 ; 84.14,34.32 84.14,35.08 83.42,35.8 ; 84.14,34.32 arc(84.16,34.16) 84.16,34.01 84.16,33.68 ; 84.14,34.32 arc(83.91,35.12) 83.42,35.8 ; 84.14,33.99 84.14,32.94 84.16,32.92 ; 84.14,33.99 arc(84.15,33.84) 84.16,33.68 ; 3V3.2 9.98,20.98 ; 9.98,20.98 9.98,18.44 ; 9.98,20.98 H2.2 ; 9.98,20.98 10.23,20.98 10.36,21.11 ; v1(65.09,6.89) 63.7,5.49 J_IN0.12 ; v1(65.09,6.89) v1(65.09,6.11) ; v1(65.09,6.89) v1(65.09,7.65) ; v1(81.35,8.66) 83.85,8.66 83.89,8.62 ; 84.16,33.68 84.16,32.92 ; 84.16,33.68 arc(84.4,32.88) 84.89,32.2 ; 84.16,32.92 84.89,32.2 ; 84.16,32.92 84.16,28.88 ; 59.68,45.03 58.93,44.29 58.93,43.24 ; 59.68,45.03 arc(59.13,44.21) 58.93,43.24 ; 83.42,35.8 70.79,48.43 ; 25.62,49.92 24.57,49.92 23.82,49.18 ; 25.62,49.92 arc(24.65,49.73) 23.82,49.18 ; 13.54,42.94 13.41,43.08 12.73,43.08 ; 13.54,42.94 arc(13.14,43.04) 12.73,43.08 ; 64.88,49.18 68.99,49.18 ; 4.15,42.34 4.9,43.08 5.95,43.08 ; 4.15,42.34 arc(4.98,42.89) 5.95,43.08 ; MODE_REQ.3 15.06,40.76 arc(15.06,40.78) 15.06,40.8 ; MODE_REQ.3 23.82,49.18 ; MODE_REQ.3 15.06,40.8 ; 5.95,43.08 12.27,43.08 ; 3V3.8 3V3.7 ; 84.89,32.2 86.19,30.89 ; 86.26,7.44 87,8.19 87,9.24 ; 86.26,7.44 83.89,5.08 ; 86.26,7.44 arc(86.81,8.27) 87,9.24 ; 9.98,18.44 3V3.1 11.17,18.44 16.45,18.44 17.16,19.15 17.16,20.15 16.45,20.86 10.23,20.86 ; 9.98,18.44 10.23,18.44 10.36,18.57 ; 9.98,18.44 H2.1 H2.2 ; 87,9.24 87,16.24 86.94,16.3 86.94,29.09 ; 70.79,48.43 70.05,49.18 68.99,49.18 ; 70.79,48.43 arc(69.97,48.98) 68.99,49.18 ; 58.93,43.24 58.93,42.34 ; 12.27,43.08 12.73,43.08 ; 84.16,28.88 arc(84.68,30.12) 85.92,30.63 ; 86.94,29.09 86.94,30.15 86.19,30.89 ; 86.94,29.09 arc(86.74,30.07) 86.19,30.89 ; 58.91,42.32 58.91,41.66 ; 15.06,40.67 arc(15.8,42.46) 17.6,43.21
  Bottom Layer w1.5: v1(65.09,6.89) v1(65.09,7.65) 66.62,7.65 67.38,6.89 ; v1(65.09,6.89) 67.38,6.89 ; v1(65.09,6.89) v1(65.09,6.11) 66.61,6.11 67.38,6.89 ; 80.72,8.03 81.23,8.03 v1(81.35,7.91) v1(81.35,8.66) 80.72,8.03 ; 80.72,8.03 68.52,8.03 67.38,6.89
5V: length 61.7
  Top Layer w1.5: 9.98,8.11 10.07,8.11 ; 9.98,8.11 9.98,7.04 9.98,7.03 ; 9.98,8.11 9.98,9.38 9.98,9.38 ; 10.07,8.11 10.07,8.63 10.74,9.3 16.34,9.3 5V.8 ; 10.07,8.11 10.07,7.68 10.99,6.76 17.43,6.76 17.6,6.92 ; 10.07,8.11 17.57,8.11 17.6,8.13 ; 9.98,7.03 5V.1 5V.3 5V.5 5V.7 17.6,6.92 ; 9.98,7.03 9.83,6.89 H4.1 5.28,9.43 9.93,9.43 9.98,9.38 ; 17.6,6.92 17.6,8.13 ; 5V.8 5V.6 5V.4 5V.2 9.98,9.38 ; 5V.8 17.6,8.13
GND: length 198.3
  Top Layer w0.3: FPC1.9 63.44,40.23 63.44,40.73 ; U3.8 53.16,18.62 v1(53.16,18.57) ; v1(45.54,17.05) 47.31,17.05 v1(47.7,17.43) ; v1(77.79,1.55) 76.91,1.55 76.75,1.38 70.22,1.38 70.17,1.42 67.63,1.42 v1(66.87,2.19) ; J_IN0PZ.10 J_IN0PZ.9 J_IN0.10 ; v1(58.24,23.97) 58.24,25.02 v1(58.49,25.28) ; FPC1.21 FPC1.22 56.87,40.16 56.87,39.63 56.69,39.45 56.16,39.45 55.47,38.76 NOREF#8.1 ; v1(68.78,29.49) 66.49,31.78 v1(63.57,31.78) ; 63.44,40.73 NOREF#10.1 ; 63.44,40.73 FPC1.10 ; v1(58.49,28.48) 59.66,27.3 C12.2 ; 64.11,19.5 63.43,18.82 63.19,18.82 ; 76.14,17.17 76.14,17.55 U1.8
  Top Layer w0.5: v1(42.11,30.63) 43.12,30.63 v1(44.39,31.9)
  Top Layer w0.6: 56.33,44.07 56.35,44.09 ; 56.33,44.07 56.33,44.1 ; 56.33,44.07 v1(56.33,43.2) ; 56.33,44.07 v1(55.44,43.18) ; 56.35,44.09 56.33,44.1 ; 56.35,44.09 56.47,44.21 ; 56.35,44.09 v1(57.22,43.21) ; 56.33,44.1 56.22,44.21 ; 56.33,44.1 56.33,44.21 ; U4.8 41.46,19.5 v1(41.25,19.71) ; 55.44,44.99 v1(55.44,45.37) v1(56.33,45.37) ; 55.44,44.99 55.47,44.96 ; 55.44,44.99 55.44,44.21 ; 57.22,44.96 v1(57.22,45.37) v1(56.33,45.37) ; 57.22,44.96 56.33,44.96 ; 57.22,44.96 57.22,44.12 ; 57.22,44.96 56.47,44.21 ; v1(56.33,45.37) 56.33,44.96 ; v1(55.44,43.18) 57.19,43.18 v1(57.22,43.21) ; v1(55.44,43.18) 55.44,44.21 ; 56.22,44.21 55.47,44.96 ; 56.22,44.21 55.44,44.21 ; 56.22,44.21 56.33,44.21 ; 56.47,44.21 57.12,44.21 57.22,44.12 ; 56.47,44.21 56.33,44.21 ; 55.47,44.96 56.33,44.96 ; 56.33,44.96 56.33,44.21 ; v1(57.22,43.21) 57.22,44.12
  Top Layer w0.8: v1(47.44,8.16) v1(42.74,8.16)
  Top Layer w1.2: 78.81,36.22 79.19,36.6 ; 78.81,36.22 76.02,33.43 NOREF.1 ; 78.81,36.22 78.05,36.22 75,33.17 ; 78.81,36.22 80.33,36.22 ; 80.33,36.22 NOREF#14.1 NOREF.1 ; 80.33,36.22 NOREF#13.2 NOREF#5.3 75.89,31.78 NOREF.1
  Bottom Layer w0.3: NOREF#4.1 85.29,3.2 85.29,1.38 84.44,0.54 84.14,0.54 82.14,2.54 81.35,2.54 80.2,1.38 78.33,1.38 78.17,1.55 v1(77.79,1.55) ; v1(58.49,25.28) v1(58.49,28.48) ; v1(44.14,18.7) 44.14,18.69 44.42,18.69 44.78,19.05 45.28,19.05 45.64,18.69 45.64,17.14 v1(45.54,17.05) ; v1(66.87,2.19) 61.9,2.19 61.51,1.8 59.64,1.8 J_IN0.9 ; v1(47.7,17.43) 52.01,17.43 v1(53.16,18.57) ; v1(58.24,23.97) 58.24,23.88 v1(63.19,18.92) ; v1(76.14,16.95) 78.45,14.64 79.29,14.64 80.44,13.49 J_IN1PZ.10 ; v1(63.57,31.78) 62.68,30.89 NOREF#9.1 ; v1(68.78,29.49) 69.54,28.73 v1(70.17,28.73)
  Bottom Layer w0.5: v1(41.25,19.71) 39.19,19.71 NOREF#7.1 ; J_IN1PZ.10 83.64,15.78 NOREF#12.1 ; v1(44.39,31.9) 45.03,31.9 NOREF#6.1 46.42,30.5 v1(49.62,27.3) ; v1(34.87,36.22) 36.52,36.22 v1(42.11,30.63)
  Bottom Layer w1.5: v1(47.44,8.16) 55.95,8.16 arc(57.75,7.41) 58.49,5.62 J_IN0.10
  vias: v1(4.26,27.97) v1(4.28,27.08) v1(5.15,27.97) v1(5.15,27.08) v1(6.08,27.97) v1(6.11,27.08) v1(34.87,37.06) v1(38.42,10.19) v1(38.42,9.27) v1(38.42,8.11) v1(38.46,11.2) v1(42.74,11.2) v1(42.74,10.24) v1(42.74,9.3) v1(53.03,27.59) v1(59.63,31.02) v1(59.63,30.2) v1(63.82,35.21) v1(63.82,34.34) v1(66.83,10.95) v1(67.38,10.19) v1(67.63,11.58) v1(68.14,10.7)
CAM0_IO0: length 21.4
  Top Layer w0.3: FPC1.1 68.27,39.35 68.27,34.44 v1(67.76,33.94) ; v1(75.38,24.92) 75.38,24.6 75.35,24.57 75.35,23.86 74.9,23.4 74.19,23.4
  Bottom Layer w0.3: v1(67.76,33.94) 67.76,32.54 v1(75.38,24.92)
CAM0_IO1: length 25.8
  Top Layer w0.3: FPC1.8 63.92,39.46 63.73,39.27 63.73,36.93 67.32,33.33 67.99,33.33 v1(68.52,32.79) ; U1.5 74.96,21.45 v1(76.02,22.51)
  Bottom Layer w0.3: v1(68.52,32.79) 76.02,25.3 76.02,24 76.37,23.65 76.37,23.14 76.02,22.79 v1(76.02,22.51)
CAM0_IO2: length 25.6
  Top Layer w0.3: U1.11 78.74,20.8 v1(76.91,22.63) ; v1(66.82,35.67) 66.82,39.59 66.87,39.63 66.87,40.16 FPC1.2
  Bottom Layer w0.3: v1(66.82,35.67) 67.95,34.54 68.01,34.54 68.37,34.19 68.37,34.12 76.91,25.59 v1(76.91,22.63)
CAM0_IO3: length 24.8
  Top Layer w0.3: FPC1.7 64.37,40.16 64.37,39.63 64.33,39.6 v1(64.33,39.02) ; U1.14 v1(78.43,22.75)
  Bottom Layer w0.3: v1(64.33,39.02) 78.43,24.92 v1(78.43,22.75)
CAM0_IO4: length 26.5
  Top Layer w0.3: v1(63.32,28.73) v1(65.48,28.73) ; 64.11,23.4 v1(62.94,23.4) ; v1(68.9,30.51) 68.9,32.32 69.13,32.54 69.13,33.05 68.9,33.27 68.9,40.03 67.63,41.3 66.87,41.3 66.42,40.85 FPC1.3
  Bottom Layer w0.3: v1(63.32,28.73) 62.94,28.35 v1(62.94,23.4) ; v1(68.9,30.51) 67.25,28.86 67.07,28.86 66.94,28.73 v1(65.48,28.73)
CAM0_IO5: length 33.6
  Top Layer w0.3: v1(62.17,27.46) v1(66.24,27.46) ; 64.11,21.45 63.4,21.45 62.17,22.68 62.17,22.76 ; FPC1.6 64.92,41.76 65.98,42.83 66.74,42.83 68.4,41.18 68.4,41.11 69.53,39.97 69.53,29.36 68.78,28.6 v1(68.4,28.6)
  Bottom Layer w0.3: v1(62.17,22.99) v1(62.17,27.46) ; v1(68.4,28.6) 67.57,28.6 67.42,28.45 67.23,28.45 v1(66.24,27.46)
CAM0_IO6: length 29.9
  Top Layer w0.3: v1(66.97,34.67) 67.51,35.21 v1(67.51,38.51) ; v1(64.2,32.54) v1(65.73,34.06) ; 69.84,20.8 68.47,20.8 v1(68.27,20.6) ; FPC1.4 65.87,40.25 65.87,41.44 v1(66.36,41.94)
  Bottom Layer w0.3: v1(68.27,20.6) 66.21,22.66 66.21,23.15 65.6,23.75 65.6,23.9 65.54,23.97 65.24,23.97 64.67,24.54 64.59,24.54 64.23,24.9 64.23,32.51 v1(64.2,32.54) ; v1(66.36,41.94) 67,41.94 68.14,40.79 68.14,39.14 v1(67.51,38.51) ; v1(65.73,34.06) 66.24,34.06 66.87,34.7
CAM0_IO7: length 22.4
  Top Layer w0.3: v1(64.84,25.15) 65.21,25.15 65.24,25.18 65.75,25.18 65.78,25.15 66.5,25.15 v1(67.63,24.01) ; v1(68.14,22.76) 68.15,22.75 69.84,22.75 ; v1(65.48,36.98) 65.48,39.62 65.46,39.63 65.46,40.16 FPC1.5
  Bottom Layer w0.3: v1(68.14,22.76) 68.14,23.5 v1(67.63,24.01) ; v1(65.48,36.98) 66.24,36.22 66.24,35.94 66.22,35.92 66.22,35.42 64.84,34.04 v1(64.84,25.15)
CAM1_IO0: length 20.1
  Top Layer w0.3: v1(59.48,39.17) 59.48,39.62 59.46,39.63 59.46,40.16 FPC1.17 ; v1(55.92,25.28) 56.07,25.12 56.07,24.32 55.15,23.4 54.04,23.4
  Bottom Layer w0.3: v1(59.48,39.17) 59.29,38.99 58.93,38.99 55.92,35.98 v1(55.92,25.28)
CAM1_IO1: length 22.6
  Top Layer w0.3: v1(56.71,25.28) 56.71,24.13 55.2,22.62 55.2,21.91 54.93,21.63 54.21,21.63 U3.5 ; v1(56.97,35.84) v1(58.36,35.84) ; v1(59.63,37.37) 59.92,37.65 59.92,38.69 60.11,38.89 60.11,39.4 59.92,39.59 FPC1.16
  Bottom Layer w0.3: v1(59.63,37.37) 59.63,37.11 v1(58.36,35.84) ; v1(56.97,35.84) 56.71,35.59 v1(56.71,25.28)
CAM1_IO2: length 23.6
  Top Layer w0.3: v1(57.55,25.28) 57.55,23.8 57.13,23.38 56.84,23.38 56.49,23.02 56.49,21.62 57.6,20.5 58.11,20.5 58.41,20.8 U3.11 ; v1(58.87,37.75) 58.87,40.16 FPC1.18
  Bottom Layer w0.3: v1(57.55,25.28) 57.55,35.57 57.57,35.59 57.57,36.09 57.55,36.11 57.55,36.43 v1(58.87,37.75)
CAM1_IO3: length 19.4
  Top Layer w0.3: v1(60.52,38.38) 60.52,39.57 60.46,39.63 60.46,40.16 FPC1.15 ; U3.14 61.04,22.75 61.09,22.8 61.15,22.8 61.15,23.05 v1(61.51,23.4)
  Bottom Layer w0.3: v1(60.52,38.38) 61.51,37.4 v1(61.51,23.4)
CAM1_IO4: length 24.2
  Top Layer w0.3: 43.96,23.4 46.29,23.4 v1(46.3,23.4) ; v1(56.84,37.76) 58.42,39.34 FPC1.19 ; v1(55,35.52) 47.57,28.09 v1(47.57,25.68)
  Bottom Layer w0.3: v1(47.57,25.68) 47.57,24.67 v1(46.3,23.4) ; v1(55,35.52) 55.52,36.04 55.52,36.15 56.84,37.47 v1(56.84,37.76)
CAM1_IO5: length 36.6
  Top Layer w0.3: v1(61.41,38.64) 60.92,39.12 60.92,39.74 60.92,39.75 FPC1.14 ; v1(48.33,24.79) 48.33,27.46 55.7,34.83 v1(58.36,34.83) ; v1(47.31,22.51) 46.26,21.45 U4.5 ; v1(62.17,32.03) 60.01,32.03 v1(58.87,33.17)
  Bottom Layer w0.3: v1(61.41,38.64) 62.17,37.87 v1(62.17,32.03) ; v1(48.33,24.79) 47.31,23.78 v1(47.31,22.51) ; v1(58.36,34.83) 58.36,33.68 v1(58.87,33.17)
CAM1_IO6: length 51.1
  Top Layer w0.3: v1(47.19,34.19) 47.19,33.3 v1(42.49,28.6) ; v1(45.54,16.03) 48.78,16.03 50.86,18.11 50.86,20.35 50.41,20.8 U4.11 ; FPC1.20 57.92,39.58 56.69,38.36 56.58,38.36 56.23,38.01 56.23,37.9 v1(55.57,37.24) ; v1(45.54,13.87) v1(43.12,13.87)
  Bottom Layer w0.3: v1(55.57,37.24) 50.23,37.24 v1(47.19,34.19) ; v1(42.49,28.6) 41.85,27.97 41.85,15.14 v1(43.12,13.87) ; v1(45.54,16.03) v1(45.54,13.87)
CAM1_IO7: length 25.3
  Top Layer w0.3: U4.14 51.12,22.75 v1(51.76,23.4) ; v1(60.78,37.11) 62.17,38.51 62.17,38.81 61.42,39.57 FPC1.13 61.46,40.16 ; v1(55.19,30.51) 59,34.32 v1(59.13,34.32) ; v1(54.81,25.28) 54.32,24.79 v1(52.01,24.79)
  Bottom Layer w0.3: v1(55.19,30.51) 55.19,29.49 54.81,29.11 v1(54.81,25.28) ; v1(60.78,37.11) 60.78,35.97 v1(59.13,34.32) ; v1(52.01,24.79) 51.76,24.54 v1(51.76,23.4)
DIS_U: length 124.6
  Top Layer w0.3: v1(71.06,23.4) 69.85,23.4 69.84,23.4 69.81,23.37 67.89,23.37 67.42,22.9 v1(65.6,22.9) ; v1(60.65,23.4) 59.77,23.4 59.73,23.37 57.69,23.37 v1(57.09,22.77) ; v1(85.8,4.77) 85.8,2.57 83.7,0.48 47.82,0.48 40.14,8.16 40.14,14.31 32.84,21.62 JP_EN.2 ; v1(75.76,23.4) 75.77,23.4 81.92,23.4 R34.1 83.46,22.05 85.67,19.84 v1(85.67,14.21) ; v1(50.74,23.4) 49.69,23.4
  Bottom Layer w0.3: v1(85.8,4.77) 85.67,4.89 v1(85.67,14.21) ; v1(71.06,23.4) 71.64,22.82 75.18,22.82 v1(75.76,23.4) ; v1(57.09,22.77) 51.38,22.77 v1(50.74,23.4) ; v1(60.65,23.4) 61.67,22.38 65.09,22.38 v1(65.6,22.9)
EXT0_IO0: length 34.4
  Top Layer w0.3: v1(72.21,23.42) 72.88,22.75 U1.3 ; v1(68.02,27.46) 65.86,29.62 64.84,29.62 62.78,31.68 62.78,32.28 58.59,36.48 54.3,36.48 49.22,41.56 J_EXT.1
  Bottom Layer w0.3: v1(72.21,23.42) 71.44,24.19 71.44,25.08 69.05,27.46 v1(68.02,27.46)
EXT0_IO1: length 60.8
  Top Layer w0.3: U1.6 76.58,20.8 v1(78.3,19.08)
  Bottom Layer w0.3: J_EXT.3 50.74,46.38 64.59,46.38 80.46,30.51 80.46,20.35 79.19,19.08 v1(78.3,19.08)
EXT0_IO2: length 69.6
  Top Layer w0.3: U1.10 80.63,20.15 81.08,19.7 81.08,19.31 80.97,19.19 v1(80.97,18.82)
  Bottom Layer w0.3: J_EXT.5 49.6,47.78 65.35,47.78 85.41,27.71 85.41,18.7 84.4,17.68 82.11,17.68 v1(80.97,18.82)
EXT0_IO3: length 67.6
  Top Layer w0.3: v1(47.19,43.97) 43.25,43.97 J_EXT.7 ; U1.13 81.25,22.1 v1(83.64,19.71)
  Bottom Layer w0.3: v1(83.64,19.71) 84.14,19.71 84.78,20.35 84.78,27.33 64.97,47.14 50.36,47.14 v1(47.19,43.97)
EXT0_IO4: length 99.1
  Top Layer w0.3: v1(66.74,21.11) 66.47,21.11 64.82,22.75 64.11,22.75 ; v1(38.5,48.72) 37.54,47.75 v1(37.54,45.37)
  Bottom Layer w0.3: v1(66.74,21.11) 69.54,18.32 77.64,18.32 79.08,16.88 84.73,16.88 86.17,18.32 86.18,18.32 86.22,18.36 86.22,28.11 65.64,48.69 56.53,48.69 56.42,48.8 38.58,48.8 v1(38.5,48.72) ; J_EXT.9 37.54,42.32 v1(37.54,45.37)
EXT0_IO5: length 101.9
  Top Layer w0.3: 64.11,20.8 v1(65.22,20.8) ; v1(35.76,46.26) v1(36.77,45.24)
  Bottom Layer w0.3: v1(35.76,46.26) 37.9,48.39 37.9,48.97 38.25,49.32 65.58,49.32 86.62,28.28 86.62,18.19 86.34,17.91 86.34,17.91 85.67,17.25 85.67,17.05 85.1,16.47 78.91,16.47 77.83,17.55 68.96,17.55 68.57,17.95 68.08,17.95 v1(65.22,20.8) ; v1(36.77,45.24) 35.76,44.22 J_EXT.11
EXT0_IO6: length 91.6
  Top Layer w0.3: v1(71.32,20.22) 71.25,20.15 69.84,20.15
  Bottom Layer w0.3: v1(71.32,20.22) 76.3,20.22 79.24,17.28 84.56,17.28 85.82,18.53 85.82,27.88 79.57,34.12 79.57,34.19 65.48,48.29 38.93,48.29 33.22,42.57 J_EXT.13
EXT0_IO7: length 69.9
  Top Layer w0.3: v1(49.98,44.6) 33.73,44.6 J_EXT.15 ; 69.84,22.1 71.34,22.1 v1(71.57,21.87)
  Bottom Layer w0.3: v1(49.98,44.6) 58.03,44.6 63.01,39.62 64.58,39.62 78.83,25.38 78.83,23.8 79.06,23.57 79.06,23.27 79.04,23.24 79.04,22.5 78.41,21.87 v1(71.57,21.87)
EXT1_IO0: length 19.3
  Top Layer w0.3: J_EXT.2 48.2,38.76 v1(48.2,29.75) ; U3.3 53.23,22.75 52.71,23.27 v1(52.71,23.4)
  Bottom Layer w0.3: v1(48.2,29.75) 52.71,25.24 v1(52.71,23.4)
EXT1_IO1: length 41.8
  Top Layer w0.3: U3.6 53.32,20.8 52.55,20.03 52.55,18.34 51,16.79 50.11,16.79 48.46,15.14 44.51,15.14 v1(44.29,15.36) ; J_EXT.4 45.92,35.71 40.58,30.38 40.58,19.33 41.98,17.93 v1(44.01,17.93)
  Bottom Layer w0.3: v1(44.01,17.93) 44.29,17.65 v1(44.29,15.36)
EXT1_IO2: length 42.9
  Top Layer w0.3: v1(44.14,14.51) 47.72,14.51 47.85,14.64 48.72,14.64 49.83,15.75 49.83,15.82 50.28,16.26 52.19,16.26 56.03,20.1 59.77,20.1 U3.10 ; v1(43.38,34.44) J_EXT.6
  Bottom Layer w0.3: v1(44.14,14.51) 43.38,15.27 v1(43.38,34.44)
EXT1_IO3: length 27.1
  Top Layer w0.3: v1(58.11,22.76) 58.4,22.76 59.05,22.1 U3.13
  Bottom Layer w0.3: J_EXT.8 41.85,39.02 42.17,38.69 42.17,36.66 54.93,23.9 56.97,23.9 v1(58.11,22.76)
EXT1_IO4: length 20.2
  Top Layer w0.3: v1(38.3,29.87) J_EXT.10 ; U4.3 42.37,22.75 v1(41.22,23.9)
  Bottom Layer w0.3: v1(38.3,29.87) 38.3,25.68 40.08,23.9 v1(41.22,23.9)
EXT1_IO5: length 22.9
  Top Layer w0.3: U4.6 41.78,20.8 v1(41.22,21.36) ; v1(35.76,32.79) J_EXT.12
  Bottom Layer w0.3: v1(41.22,21.36) 35.76,26.82 v1(35.76,32.79)
EXT1_IO6: length 47.1
  Top Layer w0.3: v1(33.47,33.68) 33.47,38.76 J_EXT.14 ; v1(48.33,16.64) 48.33,18.06 v1(47.7,18.68) ; U4.10 v1(48.33,20.15) ; v1(47.19,12.35) 42.87,12.35 v1(42.23,12.98)
  Bottom Layer w0.3: v1(48.33,16.64) 48.33,15.12 49.48,13.97 49.48,13.01 48.81,12.34 47.85,12.34 47.84,12.35 v1(47.19,12.35) ; v1(47.7,18.68) 48.33,19.31 v1(48.33,20.15) ; v1(42.23,12.98) 34.87,20.35 34.87,32.29 v1(33.47,33.68)
EXT1_IO7: length 26.1
  Top Layer w0.3: U4.13 48.99,22.1 48.81,22.28 48.8,22.28 48.52,22.56 48.52,22.57 v1(45.79,25.3) ; v1(44.27,25.3) v1(41.22,28.35)
  Bottom Layer w0.3: J_EXT.16 30.68,38.89 v1(41.22,28.35) ; v1(45.79,25.3) v1(44.27,25.3)
IO0_T18: length 33.7
  Top Layer w0.3: v1(68.4,16.41) 72.21,20.22 72.21,21.49 72.82,22.1 U1.4
  Top Layer w0.32: J_IN0.7 55.95,3.84 54.79,5.01 54.79,6.1 55.95,7.27 J_IN0PZ.7
  Bottom Layer w0.3: J_IN0PZ.7 56.86,10.95 58.01,9.8 61.51,9.8 62.66,10.95 63.19,10.95 68.4,16.16 v1(68.4,16.41)
IO0_Y21: length 56.1
  Top Layer w0.3: v1(52.65,22.13) 54.01,22.13 U3.4
  Top Layer w0.32: 71.19,5.08 71.19,6.38 72.35,7.54 72.35,11.93 71.19,13.09 J_IN1PZ.2
  Bottom Layer w0.3: v1(52.65,22.13) 52.01,22.13 47.96,18.07 47.45,18.07 47.02,17.64 47.02,13.24 46.42,12.65 46.42,5.62 46.96,5.08 47.11,5.08 47.85,4.34 61.51,4.34 62.25,5.08 71.19,5.08
IO1_R18: length 30
  Top Layer w0.3: J_IN0PZ.8 58.26,15.8 68.93,15.8 73.28,20.15 U1.7
  Top Layer w0.32: J_IN0PZ.8 55.95,12.59 57.11,11.43 57.11,7.83 55.95,6.67 J_IN0.8
IO1_Y22: length 34.7
  Top Layer w0.3: U3.7 54.99,20.15 v1(55.57,20.73) ; v1(58.94,18.87) 56.79,18.87 v1(56.58,19.08) ; v1(66.11,18.32) 66.11,17.05 v1(65.98,16.92) ; v1(65.15,14.66) 66.83,12.98 v1(68.14,12.98)
  Top Layer w0.32: 71.19,2.54 71.19,3.43 70.03,4.59 70.03,6.1 71.19,7.27 J_IN1PZ.1
  Bottom Layer w0.3: v1(65.15,14.66) 65.15,16.09 v1(65.98,16.92) ; v1(55.57,20.73) 56.58,19.71 v1(56.58,19.08) ; v1(58.94,18.87) 59.87,18.87 60.42,18.32 v1(66.11,18.32) ; v1(68.14,12.98) 69.16,12.98 J_IN1PZ.1
IO2_AB21: length 34.6
  Top Layer w0.3: v1(59.76,17.55) 59.76,19.5 U3.9 ; v1(69.16,6.12) 64.33,10.95 v1(64.33,14.51)
  Top Layer w0.32: 73.73,5.08 73.73,6.12 74.89,7.28 74.89,11.43 73.73,12.59 J_IN1PZ.4
  Bottom Layer w0.3: 73.73,5.08 73.22,5.58 73,5.58 71.95,6.63 71.77,6.63 71.67,6.74 70.71,6.74 70.61,6.63 69.67,6.63 v1(69.16,6.12) ; v1(64.33,14.51) 64.1,14.51 63.8,14.81 63.8,16.16 63.92,16.29 63.92,16.79 63.57,17.14 61.03,17.14 60.92,17.04 60.17,17.04 59.76,17.44 v1(59.76,17.55)
IO2_R17: length 40.3
  Top Layer w0.3: U1.9 76.7,16.28 v1(70.3,16.28)
  Top Layer w0.32: J_IN0.5 53.41,3.84 52.25,5.01 52.25,5.97 53.41,7.13 J_IN0PZ.5
  Bottom Layer w0.3: J_IN0PZ.5 54.32,10.95 55.88,9.4 61.95,9.4 62.87,10.31 64.33,10.31 v1(70.3,16.28)
IO3_AB22: length 34.6
  Top Layer w0.3: v1(57.86,21.11) 58.2,21.45 U3.12
  Top Layer w0.32: 73.73,2.54 73.73,3.43 72.57,4.59 72.57,6.23 73.73,7.39 J_IN1PZ.3
  Bottom Layer w0.3: v1(57.86,21.11) 57.86,18.95 58.64,18.16 60.01,18.16 60.63,17.55 68.4,17.55 69.03,16.92 70.94,16.92 72.34,15.51 72.34,12.34 J_IN1PZ.3
IO3_P16: length 43.6
  Top Layer w0.3: v1(56.33,15.25) 55.17,15.25 J_IN0PZ.6 ; v1(58.74,15.2) 58.82,15.27 78.56,15.27 81.73,18.44 81.73,20.35 80.63,21.45 U1.12
  Top Layer w0.32: J_IN0PZ.6 53.41,12.59 54.57,11.43 54.57,7.7 53.41,6.54 J_IN0.6
  Bottom Layer w0.3: v1(58.74,15.2) 56.39,15.2 v1(56.33,15.25)
IO4_AA20: length 64.9
  Top Layer w0.3: U4.4 43.98,22.13 v1(45.79,22.13)
  Top Layer w0.32: J_IN1PZ.6 76.27,12.59 77.43,11.43 77.43,7.28 76.27,6.12 76.27,5.08
  Bottom Layer w0.3: 76.27,5.08 75.29,4.1 73.25,4.1 72.58,3.43 72.58,1.8 72.17,1.38 47.23,1.38 45.66,2.95 45.66,12.45 46.62,13.41 46.62,21.3 v1(45.79,22.13)
IO4_U21: length 34.4
  Top Layer w0.3: v1(61.28,16.47) 62.36,16.47 64.92,19.03 65,19.03 65.28,19.31 65.28,19.39 65.86,19.97 65.86,21.07 64.82,22.1 64.11,22.1 ; 51,15.27 50.87,15.14 50.87,15.12 49.72,13.97 49.72,13.01 50.87,11.86 J_IN0PZ.3
  Top Layer w0.32: J_IN0PZ.3 50.87,7.13 49.71,5.97 49.71,5.01 50.87,3.84 J_IN0.3
  Bottom Layer w0.3: v1(51,15.25) 52.21,16.47 v1(61.28,16.47)
IO5_AA21: length 61.8
  Top Layer w0.3: U4.7 45.85,20.15 v1(45.92,20.22)
  Top Layer w0.32: 76.27,2.54 76.27,3.43 75.11,4.59 75.11,6.36 76.27,7.52 J_IN1PZ.5
  Bottom Layer w0.3: v1(45.92,20.22) 46.22,19.92 46.22,13.57 45.26,12.62 45.26,2.59 46.87,0.98 73.8,0.98 75.36,2.54 76.27,2.54
IO5_T21: length 25
  Top Layer w0.3: J_IN0PZ.4 51.63,13.49 55.09,16.95 60.17,16.95 63.38,20.15 64.11,20.15
  Top Layer w0.32: J_IN0PZ.4 50.87,12.59 52.03,11.43 52.03,7.7 50.87,6.54 J_IN0.4
IO6_AA19: length 73.2
  Top Layer w0.3: 78.81,5.08 79.96,3.92 79.96,2.76 80.2,2.52 80.2,2.06 80.22,2.04 80.22,1.55 79.54,0.88 47.99,0.88 47.48,1.38 47.48,1.41 40.65,8.25 40.65,13.05 46.89,19.29 48.09,19.29 48.38,19 49.18,19 U4.9
  Top Layer w0.32: 78.81,5.08 78.81,6.12 79.97,7.28 79.97,11.43 78.81,12.59 J_IN1PZ.8
IO6_R19: length 34.7
  Top Layer w0.3: 69.84,19.5 69.84,18.87 v1(67.38,16.41)
  Top Layer w0.32: J_IN0PZ.1 48.33,7.13 47.17,5.97 47.17,5.01 48.33,3.84 J_IN0.1
  Bottom Layer w0.3: J_IN0PZ.1 49.24,10.95 50.39,12.1 63.58,12.1 67.38,15.9 v1(67.38,16.41)
IO7_AB20: length 67
  Top Layer w0.3: v1(45.03,18.44) 48.04,21.45 U4.12
  Top Layer w0.32: 78.81,2.54 78.81,3.43 77.65,4.59 77.65,6.36 78.81,7.52 J_IN1PZ.7
  Bottom Layer w0.3: 78.81,2.54 77.9,2.54 75.94,0.58 46.51,0.58 44.86,2.23 44.86,12.78 44.9,12.83 44.9,18.32 v1(45.03,18.44)
IO7_P19: length 33.9
  Top Layer w0.3: v1(63.32,16.54) 68.23,21.45 69.84,21.45 ; v1(52.65,15.86) 50.45,15.86 50.23,15.65 50.23,15.39 J_IN0PZ.2
  Top Layer w0.32: J_IN0PZ.2 48.33,13.09 49.49,11.93 49.49,7.7 48.33,6.54 J_IN0.2
  Bottom Layer w0.3: v1(63.32,16.54) 62.64,15.86 v1(52.65,15.86)
SEL_U: length 55.8
  Top Layer w0.3: U4.1 42.97,24.05 v1(41.22,25.81) ; v1(39.44,25.81) 26.49,25.81 JP_SEL.2
  Top Layer w0.32: v1(55.46,24.57) 54.94,24.05 U3.1 51.41,24.05 v1(50.89,24.57) ; v1(46.7,26.6) 45.06,26.6 R33.1 45.05,25.14 U4.1 ; v1(60.88,24.53) 61.35,24.05 64.98,24.05 v1(65.49,24.57) ; U1.1 71.42,24.05 v1(70.83,24.65)
  Bottom Layer w0.3: v1(39.44,25.81) v1(41.22,25.81)
  Bottom Layer w0.32: v1(70.83,24.65) 65.57,24.65 v1(65.49,24.57) ; v1(55.46,24.57) 55.48,24.59 60.81,24.59 v1(60.88,24.53) ; v1(50.89,24.57) 48.86,26.6 v1(46.7,26.6)
$1N8696: length 2.9
  Top Layer w0.32: R35.1 25.71,4.62 J_AUX.1
$1N8701: length 3.4
  Top Layer w0.32: R39.1 28.26,7.76 J_AUX.2
$1N8888: length 12.6
  Top Layer w0.3: R35.2 22.8,17.43 JP_SEL.1
$1N8898: length 17.8
  Top Layer w0.3: JP_EN.1 28.14,18.7 24.33,14.89 24.33,12.73 26.12,10.93 R39.2
$1N9028: length 3.5
  Top Layer w0.32: R37.1 31.19,4.98 30.8,4.6
$1N9037: length 42.9
  Top Layer w0.3: v1(28.39,17.17) 28.39,13.51 R38.2
  Top Layer w0.32: R38.2 28.38,12.73 R37.2
  Bottom Layer w0.3: v1(28.39,17.17) 28.39,28.86 19.88,37.37 13.41,37.37 MODE_REQ.2

## Copper pours and planes (outline as drawn; the poured copper is in the pictures)
GND on Top Layer: -13.65,67.34 114.88,67.34 114.88,-22.83 -13.65,-22.83
GND on Bottom Layer: -4.5,62.89 95.45,62.89 95.45,-9.12 -4.5,-9.12

## Text on the board
Top Silkscreen Layer: P19 T21 P16  R18 GND 3V3 | R19 U21 R17  T18 GND 3V3 | Y22 AB22 AA21 AB20 GND 3V3 | Y21 AB21 AA20 AA19 GND 3V3 | FIX CAM / FPGA SEL | FORCE ON / FPGA DIS | CAM—EXT

# Board PCB2
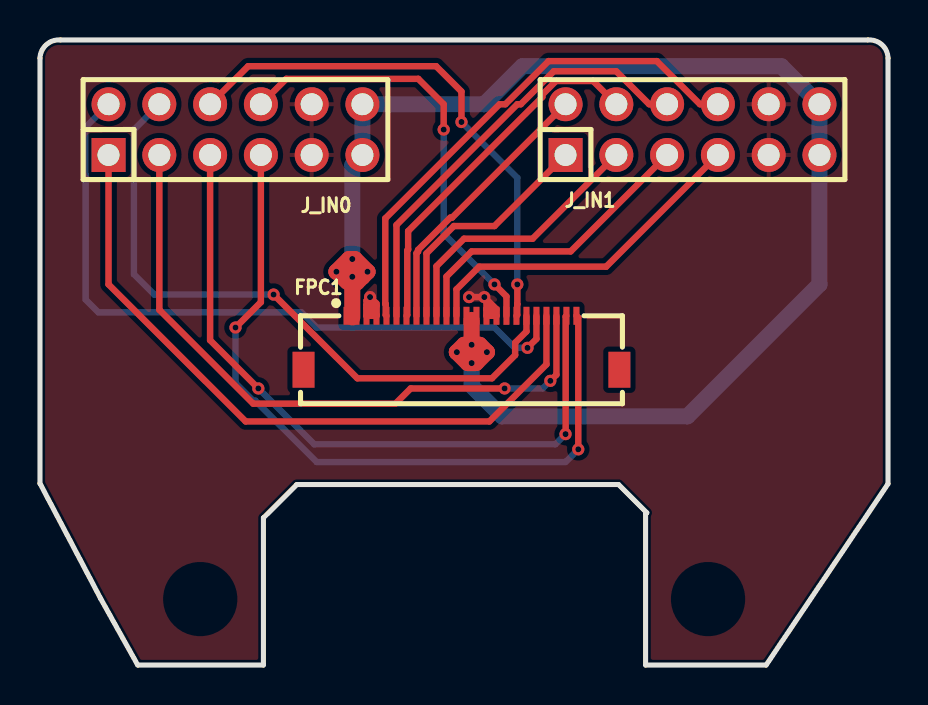
[diagram p4: board, top side]
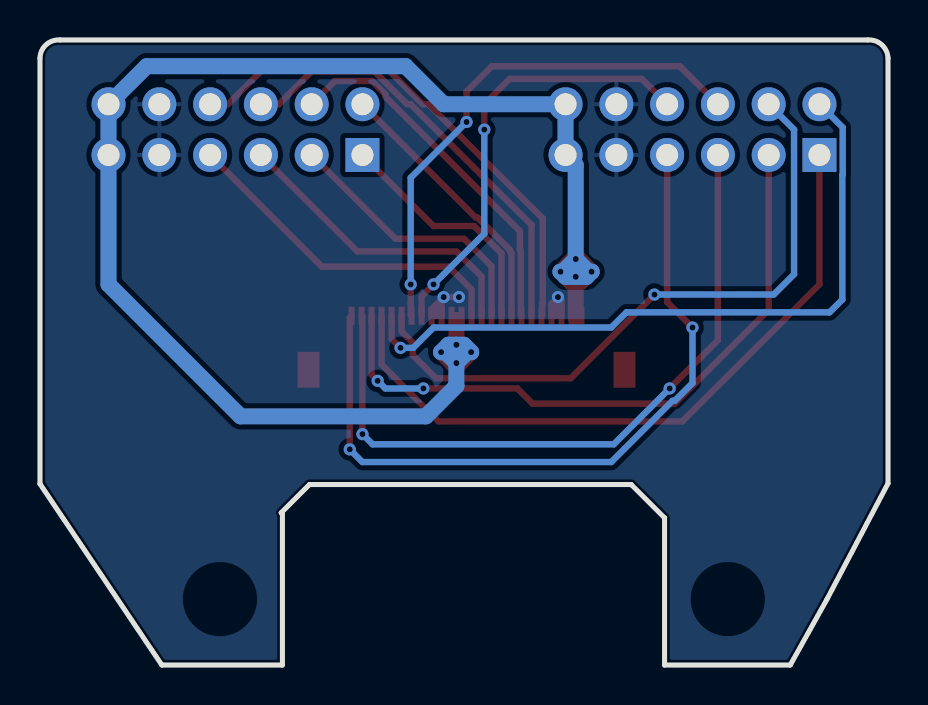
[diagram p5: board, bottom side, seen from below]

Outline 42.42 x 31.28 mm; copper layers: Top Layer, Bottom Layer. Coordinates in mm from the lower left corner of the outline.
Outline path: 0,30.37 0,9.09 3.05,3.3 4.89,0 11.18,0 11.18,7.37 12.84,9.03 28.94,9.03 30.35,7.62 30.29,7.56 30.29,0 36.32,0 42.42,9.07 42.42,30.37 arc(42.12,31.04) 41.42,31.28 1.02,31.28 arc(0.31,31.04) 0,30.37
Stack: Top Layer 0.035mm / Dielectric1 1.51mm FR4 er 4.5 / Bottom Layer 0.035mm

## Design rules (mm)
template: JLCPCB Capability(Two Layers Board)
spacing copperThickness1oz (default): track to track 0.102, other pairs 0.152 to 0.3
spacing copperThickness2oz: track to track 0.203, other pairs 0.152 to 0.3
track width copperThickness1oz (default): min 0.127, default 0.254, max 2.54
track width copperThickness2oz: min 0.203, default 0.254, max 2.54
differential pair differentialPair (default): width min 0.127, default 0.254, max 2.54; gap min 0.152, default 0.152
via viaSize (default): diameter min 0.5, default 0.61, max 10; hole min 0.3, default 0.305, max 6.3

## Placement (name value [footprint] x y rotation side)
FPC1  J_FFC_CAM  [FPC-SMD_24P-P0.50_MLD-FPC-05F-24P-H15]  21.08 16.13 0 top
J_IN0  双排针2.54mm2*6排针  [HDR-TH_12P-P2.54-V-M-R2-C6-S2.54]  9.78 26.8 0 top
J_IN1  双排针2.54mm2*6排针  [HDR-TH_12P-P2.54-V-M-R2-C6-S2.54]  32.64 26.8 0 top

## Footprints (pads in the part's own frame, mm; a bottom-side part is the same pattern mirrored in y, then rotated)
FPC-SMD_24P-P0.50_MLD-FPC-05F-24P-H15
  rect 0.3x0.9 smd: 1(-5.75,1.35) 2(-5.25,1.35) 3(-4.75,1.35) 4(-4.25,1.35) 5(-3.75,1.35) 6(-3.25,1.35) 7(-2.75,1.35) 8(-2.25,1.35) 9(-1.75,1.35) 10(-1.25,1.35) 11(-0.75,1.35) 12(-0.25,1.35) 13(0.25,1.35) 14(0.75,1.35) 15(1.25,1.35) 16(1.75,1.35) 17(2.25,1.35) 18(2.75,1.35) 19(3.25,1.35) 20(3.75,1.35) 21(4.25,1.35) 22(4.75,1.35) 23(5.25,1.35) 24(5.75,1.35)
  rect 1.1x1.8 smd: 25(7.9,-1.35) 26(-7.9,-1.35)
HDR-TH_12P-P2.54-V-M-R2-C6-S2.54
  rect 1.7x1.7 hole 1.1: 1(-6.35,-1.27)
  round 1.7 hole 1.1: 2(-6.35,1.27) 3(-3.81,-1.27) 4(-3.81,1.27) 5(-1.27,-1.27) 6(-1.27,1.27) 7(1.27,-1.27) 8(1.27,1.27) 9(3.81,-1.27) 10(3.81,1.27) 11(6.35,-1.27) 12(6.35,1.27)

## Nets
As in the schematic.

Pads without a net: FPC1 25 26

## Via types
v1: diameter 0.61, hole 0.305, Top Layer to Bottom Layer, 23 vias

## Routing (per net, layer and track width the routed paths; a pad name or vN(x,y) marks a point on that pad's centre or on a via; arc(x,y) is an arc through that point)
3V3: length 87.5
  Top Layer w0.8: v1(21.59,16.03) 21.96,15.66 v1(22.35,15.66) ; v1(21.59,16.03) v1(21.59,15.11) ; v1(21.59,16.03) 21.22,15.66 v1(20.85,15.66) ; v1(21.59,16.03) 21.59,17.27 ; v1(21.59,16.03) 21.99,16.03 v1(22.35,15.66) ; v1(21.59,16.03) 21.22,16.03 v1(20.85,15.66) ; v1(21.59,15.11) 21.4,15.11 v1(20.85,15.66) ; v1(21.59,15.11) 21.81,15.11 v1(22.35,15.66) ; 14.86,19.69 15.37,19.18 ; 14.86,19.69 v1(14.83,19.69) 15.46,20.32 v1(15.62,20.32) 15.75,20.32 v1(16.38,19.69) 16.13,19.43 ; 14.86,19.69 15.37,19.69 v1(15.62,19.43) ; 16.13,19.43 15.84,19.15 15.62,19.15 ; 16.13,19.43 v1(15.62,19.43) ; 15.62,19.15 v1(15.62,19.43) ; 15.62,19.15 15.62,17.4
  Bottom Layer w0.8: v1(21.59,16.03) 21.22,15.66 21.04,15.66 ; v1(21.59,16.03) 21.22,16.03 v1(20.85,15.66) 21.04,15.66 ; v1(21.59,16.03) 21.99,16.03 v1(22.35,15.66) 22.14,15.66 v1(21.59,15.11) ; v1(15.62,20.32) 14.99,19.69 v1(14.83,19.69) 15.08,19.43 v1(15.62,19.43) ; v1(15.62,20.32) 15.62,25.02 J_IN0.11 J_IN0.12 22.22,28.07 24.13,29.97 37.08,29.97 J_IN1.12 J_IN1.11 38.99,19.05 32.38,12.45 23.11,12.45 21.59,13.97 v1(21.59,15.11) ; v1(15.62,20.32) v1(15.62,19.43) ; v1(15.62,20.32) 16.26,19.69 v1(16.38,19.69) 16.13,19.43 v1(15.62,19.43) ; v1(21.59,15.11) 21.04,15.66
GND: length 8.2
  Top Layer w0.32: 22.33,17.81 22.33,18.31 ; 22.33,17.81 22.5,17.81 FPC1.16 ; 22.33,17.81 FPC1.15 FPC1.16 ; 22.33,18.31 v1(22.22,18.42) v1(21.46,18.42) ; 22.33,18.31 22.83,17.81 FPC1.16 ; FPC1.3 16.33,17.86 ; FPC1.3 16.6,17.75 ; FPC1.3 FPC1.4 16.83,17.52 ; 16.33,17.86 16.41,17.94 ; 16.33,17.86 16.33,18.02 ; 16.41,17.94 16.33,18.02 ; 16.41,17.94 16.51,18.03 ; 16.41,17.94 16.6,17.75 ; 16.33,18.02 16.33,18.24 v1(16.51,18.42) 16.83,18.09 16.83,17.98 ; 16.6,17.75 16.83,17.98 ; 16.6,17.75 16.83,17.52 ; 16.83,17.98 16.83,17.52
CAM0_IO0: length 37.7
  Top Layer w0.32: FPC1.24 26.92,17.39 v1(26.92,10.8) ; v1(9.78,16.89) 11.05,18.16 J_IN0.7
  Bottom Layer w0.32: v1(9.78,16.89) 9.78,14.11 10.67,13.23 10.78,13.23 13.84,10.16 26.29,10.16 v1(26.92,10.8)
CAM0_IO1: length 22.1
  Top Layer w0.32: FPC1.17 23.33,18.45 v1(22.73,19.05) ; J_IN0.8 12.32,29.34 18.92,29.34 20.19,28.07 v1(20.19,26.8)
  Bottom Layer w0.32: v1(22.73,19.05) 20.19,21.59 v1(20.19,26.8)
CAM0_IO2: length 35.4
  Top Layer w0.32: v1(26.29,11.56) 26.29,11.56 26.29,17.44 FPC1.23 ; v1(10.92,13.84) 8.51,16.26 J_IN0.5
  Bottom Layer w0.32: v1(26.29,11.56) 25.78,11.05 13.72,11.05 v1(10.92,13.84)
CAM0_IO3: length 26.3
  Top Layer w0.32: J_IN0.6 10.41,29.97 19.81,29.97 21.08,28.7 v1(21.08,27.18) ; FPC1.18 23.87,17.52 23.87,18.06 23.88,18.06 v1(23.88,19.05)
  Bottom Layer w0.32: v1(23.88,19.05) 23.88,24.38 v1(21.08,27.18)
CAM0_IO4: length 33.1
  Top Layer w0.32: v1(25.53,14.22) 25.83,14.53 FPC1.22 ; J_IN0.3 5.97,17.78 10.67,13.08 17.78,13.08 18.54,13.84 v1(23.24,13.84)
  Bottom Layer w0.32: v1(23.24,13.84) 25.15,13.84 v1(25.53,14.22)
CAM0_IO5: length 32.9
  Top Layer w0.32: FPC1.19 24.33,16.7 23.77,16.13 23.77,15.51 22.61,14.35 15.88,14.35 v1(11.68,18.54)
  Bottom Layer w0.32: v1(11.68,18.54) 5.72,18.54 4.7,19.56 4.7,26.8 J_IN0.4
CAM0_IO6: length 34.8
  Top Layer w0.32: J_IN0.1 3.43,19.05 10.29,12.19 22.48,12.19 25.33,15.05 FPC1.21
CAM0_IO7: length 35.2
  Top Layer w0.32: v1(24.38,15.88) 24.83,16.32 FPC1.20
  Bottom Layer w0.32: v1(24.38,15.88) 23.75,15.88 22.73,16.89 13.84,16.89 13.08,17.65 2.92,17.65 2.29,18.29 2.29,24.53 2.27,24.55 2.27,26.91 J_IN0.2
CAM1_IO0: length 13.7
  Top Layer w0.32: FPC1.8 18.83,20.61 18.91,20.69 18.91,20.78 20.53,22.39 20.62,22.39 J_IN1.2
CAM1_IO1: length 12.1
  Top Layer w0.32: FPC1.9 19.33,20.6 20.7,21.97 22.73,21.97 J_IN1.1
CAM1_IO2: length 18.3
  Top Layer w0.32: FPC1.7 18.37,17.52 18.37,20.75 18.41,20.79 18.41,21.72 25.13,28.43 25.13,28.55 25.81,29.23 27.67,29.23 J_IN1.4
CAM1_IO3: length 13.8
  Top Layer w0.32: FPC1.10 19.83,19.96 21.21,21.34 24.64,21.34 J_IN1.3
CAM1_IO4: length 22
  Top Layer w0.32: FPC1.6 17.83,22.02 23.88,28.07 24.05,28.07 25.7,29.72 28.82,29.72 30.47,28.07 J_IN1.6
CAM1_IO5: length 15.5
  Top Layer w0.32: FPC1.11 20.33,19.44 21.59,20.7 26.54,20.7 J_IN1.5
CAM1_IO6: length 25.7
  Top Layer w0.32: J_IN1.8 33.01,28.07 30.85,30.23 25.44,30.23 23.28,28.07 22.99,28.07 17.27,22.35 17.27,18.08 17.29,18.06 17.29,17.52 FPC1.5
CAM1_IO7: length 17.2
  Top Layer w0.32: FPC1.12 20.83,18.8 21.97,19.94 28.32,19.94 J_IN1.7

## Copper pours and planes (outline as drawn; the poured copper is in the pictures)
GND on Top Layer: -4.57,33.91 52.2,33.91 52.2,-7.37 -4.57,-7.37
GND on Bottom Layer: -2.54,32.51 48.64,32.51 48.64,-7.24 -2.54,-7.24
